# Altium project PCA950X.PrjPcb
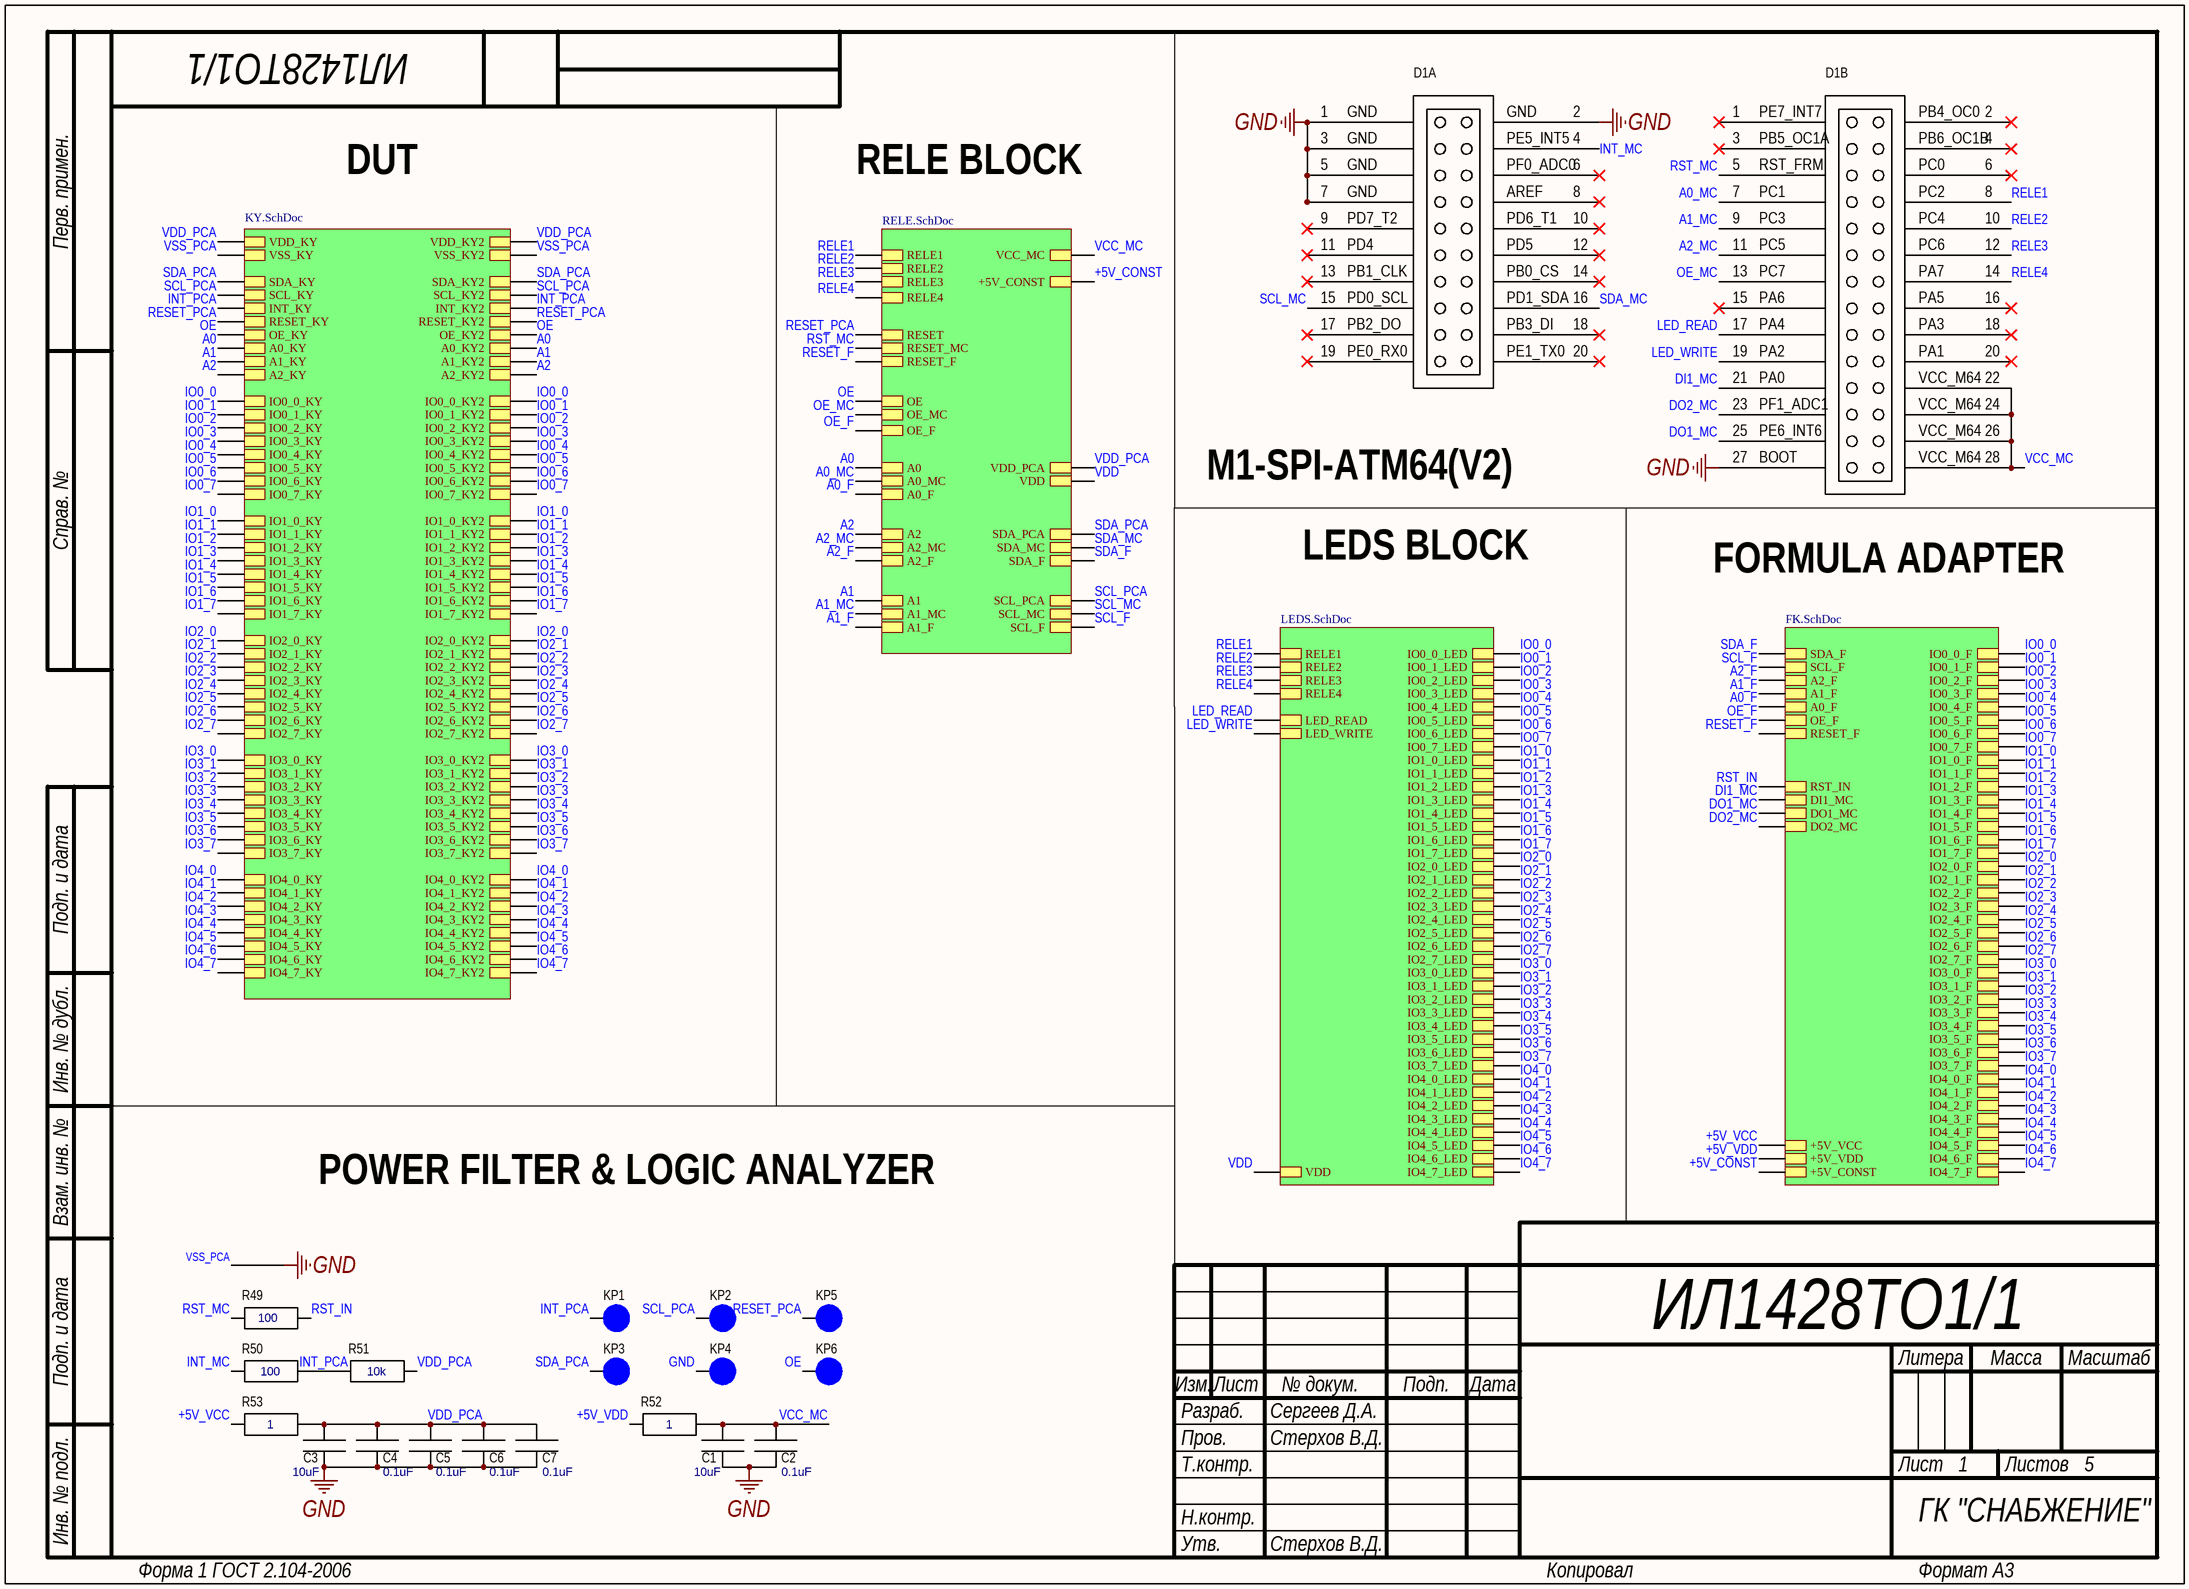
[diagram p0: Main Scheme.SchDoc]
5 sheets, 149 parts. Net scope: hierarchical (ports join the sheet entries above them; power ports are global).
Board file: PCB1.PcbDoc
Sheets:
  Main Scheme.SchDoc
    LEDS = LEDS.SchDoc
    FK = FK.SchDoc
    RELE = RELE.SchDoc
    UCP_s21 = KY.SchDoc

## Sheet Main Scheme.SchDoc: ИЛ1428ТО1/1
size 410 x 297 mm; ApprovedBy: Стерхов В.Д.; CheckedBy: Стерхов В.Д.; Author: Сергеев Д.А.; CompanyName: ГК "СНАБЖЕНИЕ"; DrawnBy: Сергеев Д.А.; Engineer: Сергеев Д.А.; Organization: ГК "СНАБЖЕНИЕ"; DocumentNumber: ИЛ1428ТО1/1; Revision: 1; SheetNumber: 1; SheetTotal: 5

### Parts
C1  10uF  [0805]
C2  0.1uF  [0805]
C3  10uF  [0805]
C4  0.1uF  [0805]
C5  0.1uF  [0805]
C6  0.1uF  [0805]
C7  0.1uF  [0805]
D1  M1-SPI-ATM64(V2)  [M1-SPI-ATM64(V2)]  (value not drawn)  (parts A,B of 2)
KP1  Contact  [Contact]  (value not drawn)
KP2  Contact  [Contact]  (value not drawn)
KP3  Contact  [Contact]  (value not drawn)
KP4  Contact  [Contact]  (value not drawn)
KP5  Contact  [Contact]  (value not drawn)
KP6  Contact  [Contact]  (value not drawn)
R49  100  [0805]
R50  100  [0805]
R51  10k  [0805]
R52  1  [0805]
R53  1  [0805]

### Sub-sheets
FK = FK.SchDoc: +5V_VCC, +5V_VDD, +5V_CONST, RESET_F, OE_F, A0_F, A1_F, A2_F, SDA_F, SCL_F, IO0_0_F, IO0_1_F, IO0_2_F, IO0_3_F, IO0_4_F, IO0_5_F, IO0_6_F, IO0_7_F, IO1_0_F, IO1_1_F, IO1_2_F, IO1_3_F, IO1_4_F, IO1_5_F, IO1_6_F, IO1_7_F, IO2_0_F, IO2_1_F, IO2_2_F, IO2_3_F, IO2_4_F, IO2_5_F, IO2_6_F, IO2_7_F, IO3_0_F, IO3_1_F, IO3_2_F, IO3_3_F, IO3_4_F, IO3_5_F, IO3_6_F, IO3_7_F, IO4_0_F, IO4_1_F, IO4_2_F, IO4_3_F, IO4_4_F, IO4_5_F, IO4_6_F, IO4_7_F, DI1_MC, DO1_MC, DO2_MC, RST_IN
LEDS = LEDS.SchDoc: VDD, IO0_0_LED, IO0_1_LED, IO0_2_LED, IO0_3_LED, IO0_4_LED, IO0_5_LED, IO0_6_LED, IO0_7_LED, IO1_0_LED, IO1_1_LED, IO1_2_LED, IO1_3_LED, IO1_4_LED, IO1_5_LED, IO1_6_LED, IO1_7_LED, IO2_0_LED, IO2_1_LED, IO2_2_LED, IO2_3_LED, IO2_4_LED, IO2_5_LED, IO2_6_LED, IO2_7_LED, IO3_0_LED, IO3_1_LED, IO3_2_LED, IO3_3_LED, IO3_4_LED, IO3_5_LED, IO3_6_LED, IO3_7_LED, IO4_0_LED, IO4_1_LED, IO4_2_LED, IO4_3_LED, IO4_4_LED, IO4_5_LED, IO4_6_LED, IO4_7_LED, RELE1, RELE2, LED_WRITE, LED_READ, RELE3, RELE4
RELE = RELE.SchDoc: +5V_CONST, SCL_PCA, SDA_PCA, SDA_MC, SCL_MC, VCC_MC, RELE1, SDA_F, SCL_F, VDD_PCA, VDD, RESET, RESET_MC, RESET_F, RELE2, A0, A0_MC, A0_F, A1, A1_MC, A1_F, RELE3, A2, A2_MC, A2_F, OE, OE_MC, OE_F, RELE4
UCP_s21 = KY.SchDoc: IO1_1_KY2, IO1_4_KY2, IO4_1_KY2, IO4_7_KY2, VDD_KY, IO4_0_KY2, IO4_4_KY2, IO4_3_KY2, VSS_KY, IO4_5_KY2, IO3_7_KY2, IO3_6_KY2, IO2_1_KY2, SCL_KY2, IO2_6_KY2, IO2_0_KY2, OE_KY2, A2_KY2, VDD_KY2, IO2_2_KY2, IO2_4_KY2, IO1_3_KY2, IO1_2_KY2, IO3_5_KY2, IO2_3_KY2, A0_KY2, IO1_7_KY2, A1_KY2, SDA_KY2, IO3_1_KY2, IO2_5_KY2, IO2_7_KY2, IO3_0_KY2, VSS_KY2, IO1_0_KY2, IO3_3_KY2, RESET_KY2, INT_KY2, IO4_2_KY2, IO4_6_KY2, IO1_6_KY2, IO3_4_KY2, INT_KY, IO1_5_KY2, IO3_2_KY2, IO0_7_KY2, IO0_5_KY2, IO0_6_KY2, SCL_KY, IO0_7_KY, IO1_3_KY, IO0_3_KY2, IO0_4_KY2, IO3_2_KY, RESET_KY, OE_KY, IO1_7_KY, IO0_3_KY, IO2_5_KY, IO3_4_KY, IO1_0_KY, IO0_6_KY, IO0_2_KY, IO2_7_KY, IO2_0_KY, IO3_1_KY, IO4_3_KY, IO0_4_KY, IO0_5_KY, IO3_7_KY, IO3_3_KY, IO3_6_KY, IO1_4_KY, IO1_5_KY, IO4_6_KY, IO4_1_KY, IO0_0_KY2, IO2_2_KY, IO0_1_KY, IO3_0_KY, IO2_1_KY, IO3_5_KY, IO1_1_KY, IO4_4_KY, IO4_2_KY, A0_KY, A1_KY, IO1_2_KY, IO2_3_KY, IO0_2_KY2, A2_KY, IO2_4_KY, IO4_7_KY, IO0_1_KY2, IO1_6_KY, SDA_KY, IO4_5_KY, IO2_6_KY, IO0_0_KY, IO4_0_KY

### Nets
GND: C1.2 C2.2 C3.2 C4.2 C5.2 C6.2 C7.2 D1.1X2 D1.2X2 D1.3X2 D1.5X2 D1.7X2 D1.27X3 KP4.1 ; sheet UCP_s21/VSS_KY, sheet UCP_s21/VSS_KY2  [also labelled VSS_PCA]
+5V_CONST: sheet FK/+5V_CONST, sheet RELE/+5V_CONST
+5V_VCC: R53.1 ; sheet FK/+5V_VCC
+5V_VDD: R52.1 ; sheet FK/+5V_VDD
A0: sheet RELE/A0, sheet UCP_s21/A0_KY2, sheet UCP_s21/A0_KY
A0_F: sheet FK/A0_F, sheet RELE/A0_F
A0_MC: D1.7X3 ; sheet RELE/A0_MC
A1: sheet RELE/A1, sheet UCP_s21/A1_KY2, sheet UCP_s21/A1_KY
A1_F: sheet FK/A1_F, sheet RELE/A1_F
A1_MC: D1.9X3 ; sheet RELE/A1_MC
A2: sheet RELE/A2, sheet UCP_s21/A2_KY2, sheet UCP_s21/A2_KY
A2_F: sheet FK/A2_F, sheet RELE/A2_F
A2_MC: D1.11X3 ; sheet RELE/A2_MC
DI1_MC: D1.21X3 ; sheet FK/DI1_MC
DO1_MC: D1.25X3 ; sheet FK/DO1_MC
DO2_MC: D1.23X3 ; sheet FK/DO2_MC
INT_MC: D1.4X2 R50.1
INT_PCA: KP1.1 R50.2 R51.1 ; sheet UCP_s21/INT_KY2, sheet UCP_s21/INT_KY
IO0_0: sheet LEDS/IO0_0_LED, sheet FK/IO0_0_F, sheet UCP_s21/IO0_0_KY2, sheet UCP_s21/IO0_0_KY
IO0_1: sheet LEDS/IO0_1_LED, sheet FK/IO0_1_F, sheet UCP_s21/IO0_1_KY, sheet UCP_s21/IO0_1_KY2
IO0_2: sheet LEDS/IO0_2_LED, sheet FK/IO0_2_F, sheet UCP_s21/IO0_2_KY, sheet UCP_s21/IO0_2_KY2
IO0_3: sheet LEDS/IO0_3_LED, sheet FK/IO0_3_F, sheet UCP_s21/IO0_3_KY2, sheet UCP_s21/IO0_3_KY
IO0_4: sheet LEDS/IO0_4_LED, sheet FK/IO0_4_F, sheet UCP_s21/IO0_4_KY2, sheet UCP_s21/IO0_4_KY
IO0_5: sheet LEDS/IO0_5_LED, sheet FK/IO0_5_F, sheet UCP_s21/IO0_5_KY2, sheet UCP_s21/IO0_5_KY
IO0_6: sheet LEDS/IO0_6_LED, sheet FK/IO0_6_F, sheet UCP_s21/IO0_6_KY2, sheet UCP_s21/IO0_6_KY
IO0_7: sheet LEDS/IO0_7_LED, sheet FK/IO0_7_F, sheet UCP_s21/IO0_7_KY2, sheet UCP_s21/IO0_7_KY
IO1_0: sheet LEDS/IO1_0_LED, sheet FK/IO1_0_F, sheet UCP_s21/IO1_0_KY2, sheet UCP_s21/IO1_0_KY
IO1_1: sheet LEDS/IO1_1_LED, sheet FK/IO1_1_F, sheet UCP_s21/IO1_1_KY2, sheet UCP_s21/IO1_1_KY
IO1_2: sheet LEDS/IO1_2_LED, sheet FK/IO1_2_F, sheet UCP_s21/IO1_2_KY2, sheet UCP_s21/IO1_2_KY
IO1_3: sheet LEDS/IO1_3_LED, sheet FK/IO1_3_F, sheet UCP_s21/IO1_3_KY2, sheet UCP_s21/IO1_3_KY
IO1_4: sheet LEDS/IO1_4_LED, sheet FK/IO1_4_F, sheet UCP_s21/IO1_4_KY2, sheet UCP_s21/IO1_4_KY
IO1_5: sheet LEDS/IO1_5_LED, sheet FK/IO1_5_F, sheet UCP_s21/IO1_5_KY2, sheet UCP_s21/IO1_5_KY
IO1_6: sheet LEDS/IO1_6_LED, sheet FK/IO1_6_F, sheet UCP_s21/IO1_6_KY2, sheet UCP_s21/IO1_6_KY
IO1_7: sheet LEDS/IO1_7_LED, sheet FK/IO1_7_F, sheet UCP_s21/IO1_7_KY2, sheet UCP_s21/IO1_7_KY
IO2_0: sheet LEDS/IO2_0_LED, sheet FK/IO2_0_F, sheet UCP_s21/IO2_0_KY2, sheet UCP_s21/IO2_0_KY
IO2_1: sheet LEDS/IO2_1_LED, sheet FK/IO2_1_F, sheet UCP_s21/IO2_1_KY2, sheet UCP_s21/IO2_1_KY
IO2_2: sheet LEDS/IO2_2_LED, sheet FK/IO2_2_F, sheet UCP_s21/IO2_2_KY2, sheet UCP_s21/IO2_2_KY
IO2_3: sheet LEDS/IO2_3_LED, sheet FK/IO2_3_F, sheet UCP_s21/IO2_3_KY2, sheet UCP_s21/IO2_3_KY
IO2_4: sheet LEDS/IO2_4_LED, sheet FK/IO2_4_F, sheet UCP_s21/IO2_4_KY2, sheet UCP_s21/IO2_4_KY
IO2_5: sheet LEDS/IO2_5_LED, sheet FK/IO2_5_F, sheet UCP_s21/IO2_5_KY2, sheet UCP_s21/IO2_5_KY
IO2_6: sheet LEDS/IO2_6_LED, sheet FK/IO2_6_F, sheet UCP_s21/IO2_6_KY2, sheet UCP_s21/IO2_6_KY
IO2_7: sheet LEDS/IO2_7_LED, sheet FK/IO2_7_F, sheet UCP_s21/IO2_7_KY2, sheet UCP_s21/IO2_7_KY
IO3_0: sheet LEDS/IO3_0_LED, sheet FK/IO3_0_F, sheet UCP_s21/IO3_0_KY2, sheet UCP_s21/IO3_0_KY
IO3_1: sheet LEDS/IO3_1_LED, sheet FK/IO3_1_F, sheet UCP_s21/IO3_1_KY2, sheet UCP_s21/IO3_1_KY
IO3_2: sheet LEDS/IO3_2_LED, sheet FK/IO3_2_F, sheet UCP_s21/IO3_2_KY2, sheet UCP_s21/IO3_2_KY
IO3_3: sheet LEDS/IO3_3_LED, sheet FK/IO3_3_F, sheet UCP_s21/IO3_3_KY2, sheet UCP_s21/IO3_3_KY
IO3_4: sheet LEDS/IO3_4_LED, sheet FK/IO3_4_F, sheet UCP_s21/IO3_4_KY2, sheet UCP_s21/IO3_4_KY
IO3_5: sheet LEDS/IO3_5_LED, sheet FK/IO3_5_F, sheet UCP_s21/IO3_5_KY2, sheet UCP_s21/IO3_5_KY
IO3_6: sheet LEDS/IO3_6_LED, sheet FK/IO3_6_F, sheet UCP_s21/IO3_6_KY2, sheet UCP_s21/IO3_6_KY
IO3_7: sheet LEDS/IO3_7_LED, sheet FK/IO3_7_F, sheet UCP_s21/IO3_7_KY2, sheet UCP_s21/IO3_7_KY
IO4_0: sheet LEDS/IO4_0_LED, sheet FK/IO4_0_F, sheet UCP_s21/IO4_0_KY2, sheet UCP_s21/IO4_0_KY
IO4_1: sheet LEDS/IO4_1_LED, sheet FK/IO4_1_F, sheet UCP_s21/IO4_1_KY2, sheet UCP_s21/IO4_1_KY
IO4_2: sheet LEDS/IO4_2_LED, sheet FK/IO4_2_F, sheet UCP_s21/IO4_2_KY2, sheet UCP_s21/IO4_2_KY
IO4_3: sheet LEDS/IO4_3_LED, sheet FK/IO4_3_F, sheet UCP_s21/IO4_3_KY2, sheet UCP_s21/IO4_3_KY
IO4_4: sheet LEDS/IO4_4_LED, sheet FK/IO4_4_F, sheet UCP_s21/IO4_4_KY2, sheet UCP_s21/IO4_4_KY
IO4_5: sheet LEDS/IO4_5_LED, sheet FK/IO4_5_F, sheet UCP_s21/IO4_5_KY2, sheet UCP_s21/IO4_5_KY
IO4_6: sheet LEDS/IO4_6_LED, sheet FK/IO4_6_F, sheet UCP_s21/IO4_6_KY2, sheet UCP_s21/IO4_6_KY
IO4_7: sheet LEDS/IO4_7_LED, sheet FK/IO4_7_F, sheet UCP_s21/IO4_7_KY2, sheet UCP_s21/IO4_7_KY
LED_READ: D1.17X3 ; sheet LEDS/LED_READ
LED_WRITE: D1.19X3 ; sheet LEDS/LED_WRITE
OE: KP6.1 ; sheet RELE/OE, sheet UCP_s21/OE_KY2, sheet UCP_s21/OE_KY
OE_F: sheet FK/OE_F, sheet RELE/OE_F
OE_MC: D1.13X3 ; sheet RELE/OE_MC
RELE1: D1.8X3 ; sheet LEDS/RELE1, sheet RELE/RELE1
RELE2: D1.10X3 ; sheet LEDS/RELE2, sheet RELE/RELE2
RELE3: D1.12X3 ; sheet LEDS/RELE3, sheet RELE/RELE3
RELE4: D1.14X3 ; sheet LEDS/RELE4, sheet RELE/RELE4
RESET_F: sheet FK/RESET_F, sheet RELE/RESET_F
RESET_PCA: KP5.1 ; sheet RELE/RESET, sheet UCP_s21/RESET_KY2, sheet UCP_s21/RESET_KY  [project net RESET]
RST_IN: R49.2 ; sheet FK/RST_IN
RST_MC: D1.5X3 R49.1 ; sheet RELE/RESET_MC  [project net RESET_MC]
SCL_F: sheet FK/SCL_F, sheet RELE/SCL_F
SCL_MC: D1.15X2 ; sheet RELE/SCL_MC
SCL_PCA: KP2.1 ; sheet RELE/SCL_PCA, sheet UCP_s21/SCL_KY2, sheet UCP_s21/SCL_KY
SDA_F: sheet FK/SDA_F, sheet RELE/SDA_F
SDA_MC: D1.16X2 ; sheet RELE/SDA_MC
SDA_PCA: KP3.1 ; sheet RELE/SDA_PCA, sheet UCP_s21/SDA_KY2, sheet UCP_s21/SDA_KY
VCC_MC: C1.1 C2.1 D1.22X3 D1.24X3 D1.26X3 D1.28X3 R52.2 ; sheet RELE/VCC_MC
VDD: sheet LEDS/VDD, sheet RELE/VDD
VDD_PCA: C3.1 C4.1 C5.1 C6.1 C7.1 R51.2 R53.2 ; sheet RELE/VDD_PCA, sheet UCP_s21/VDD_KY, sheet UCP_s21/VDD_KY2

Not connected (* = marked no-connect by the designer): D1 1X3* 2X3* 3X3* 4X3* 6X2* 6X3* 8X2* 9X2* 10X2* 11X2* 12X2* 13X2* 14X2* 15X3* 16X3* 17X2* 18X2* 18X3* 19X2* 20X2* 20X3*

### Notes on the sheet
- DUT
- RELE BLOCK
- M1-SPI-ATM64(V2)
- LEDS BLOCK
- FORMULA ADAPTER
- POWER FILTER & LOGIC ANALYZER
- Перв. примен.
- Справ. №
- Подп. и дата
- Инв. № дубл.
- Взам. инв. №
- Разраб.
- Изм.
- Лист
- № докум.
- Подп.
- Дата
- Литера
- Масса
- Масштаб
- Пров.
- Т.контр.
- Листов
- Инв. № подл.
- Н.контр.
- Утв.
- Форма 1 ГОСТ 2.104-2006
- Копировал
- Формат А3
- (in symbol 9DB102BGILF) PLL_BW; VDDA; PCIE BUF; CLK_INT; GNDA; CLK_INC; IREF; vCLKREQ0#; vCLKREQ1#; VDD; GND; PCIEXT0; PCIEXT2; PCIEXC0; PCIEXC1; SMBDAT; SMBCLK
- (in symbol M1-SPI-ATM64(V2), part A) GND; 3; PE5_INT5; 4; 5; PF0_ADC0; 6; 7; AREF; 8; 9; PD7_T2; PD6_T1; 10; 11; PD4; PD5; 12; 13; PB1_CLK; PB0_CS; 14; 15; PD0_SCL; PD1_SDA; 16; 17; PB2_DO; PB3_DI; 18; 19; PE0_RX0; PE1_TX0; 20
- (in symbol M1-SPI-ATM64(V2), part B) PE7_INT7; PB4_OC0; 3; PB5_OC1A; PB6_OC1B; 4; 5; RST_FRM; PC0; 6; 7; PC1; PC2; 8; 9; PC3; PC4; 10; 11; PC5; PC6; 12; 13; PC7; PA7; 14; 15; PA6; PA5; 16; 17; PA4; PA3; 18; 19; PA2; PA1; 20; 21; PA0; VCC_M64; 22; 23; PF1_ADC1; 24; 25; PE6_INT6; 26; 27; BOOT; 28
- (in symbol MCP1700T-3302E/TT) *STU

### Library data of the parts
C1-C7 = C0805: ComponentHeigt: 1.3; Firme: AVX; Leadform: SMD; KIND: Конденсатор; ClassName: *; Component Link: *; ComponentWeigt: *; Packaging: 0805; NN: *; Value: *
D1 = M1-SPI-ATM64(V2): ComponentHeigt: 5.5; Name: Вилка; Specification: Вилка PLD2-2 *; Typ: PLD2-2; ClassName: *; Component Link: *; ComponentWeigt: *; Firme: *; Leadform: *; NN: *; KIND: *
R49-R53 = R0805 Yageo: ComponentHeigt: 0.6; Firme: Yageo; Leadform: SMD; Kind: Резистор; ClassName: *; ComponentWeigt: *; Component Link: *; Packaging: 0805; NN: *; Value: *

## Sheet LEDS.SchDoc: ИЛ1428ТО1/1
size 410 x 297 mm; ApprovedBy: Стерхов В.Д.; CheckedBy: Стерхов В.Д.; Author: Сергеев Д.А.; CompanyName: ГК "СНАБЖЕНИЕ"; DrawnBy: Сергеев Д.А.; Engineer: Сергеев Д.А.; Organization: ГК "СНАБЖЕНИЕ"; DocumentNumber: ИЛ1428ТО1/1; Revision: 1; SheetNumber: 3; SheetTotal: 5
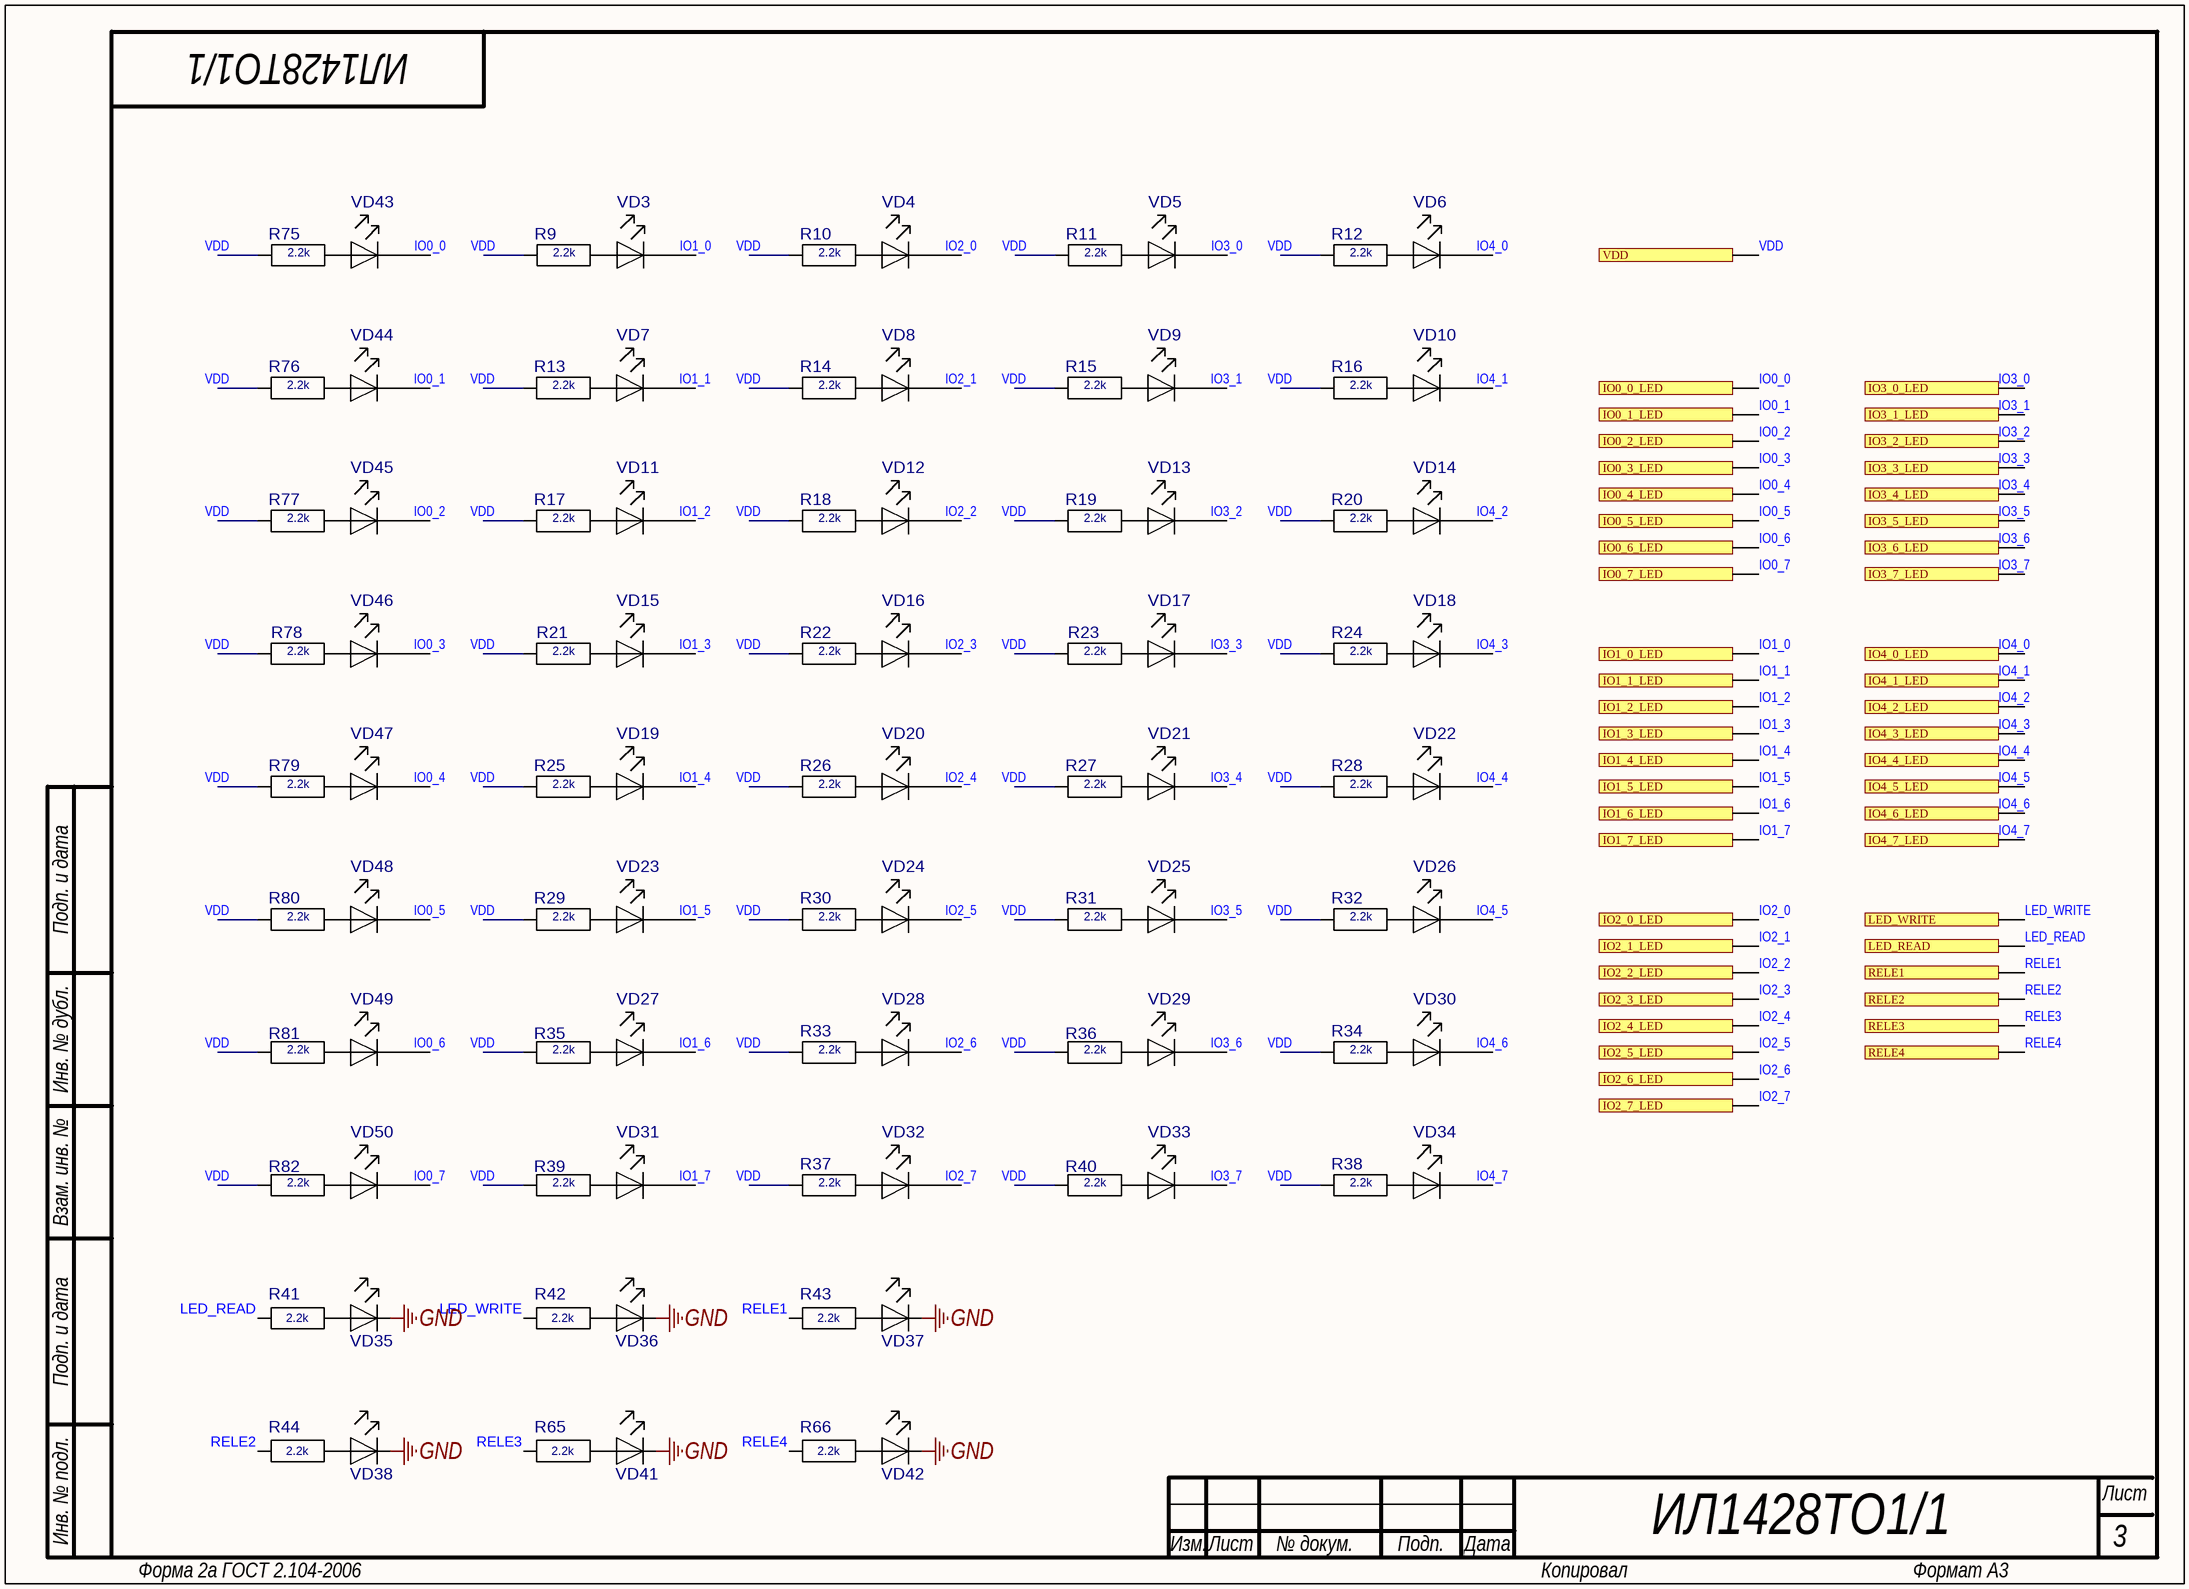
[diagram p1: LEDS.SchDoc]

### Parts
R9  2.2k  [0805]
R10  2.2k  [0805]
R11  2.2k  [0805]
R12  2.2k  [0805]
R13  2.2k  [0805]
R14  2.2k  [0805]
R15  2.2k  [0805]
R16  2.2k  [0805]
R17  2.2k  [0805]
R18  2.2k  [0805]
R19  2.2k  [0805]
R20  2.2k  [0805]
R21  2.2k  [0805]
R22  2.2k  [0805]
R23  2.2k  [0805]
R24  2.2k  [0805]
R25  2.2k  [0805]
R26  2.2k  [0805]
R27  2.2k  [0805]
R28  2.2k  [0805]
R29  2.2k  [0805]
R30  2.2k  [0805]
R31  2.2k  [0805]
R32  2.2k  [0805]
R33  2.2k  [0805]
R34  2.2k  [0805]
R35  2.2k  [0805]
R36  2.2k  [0805]
R37  2.2k  [0805]
R38  2.2k  [0805]
R39  2.2k  [0805]
R40  2.2k  [0805]
R41  2.2k  [0805]
R42  2.2k  [0805]
R43  2.2k  [0805]
R44  2.2k  [0805]
R65  2.2k  [0805]
R66  2.2k  [0805]
R75  2.2k  [0805]
R76  2.2k  [0805]
R77  2.2k  [0805]
R78  2.2k  [0805]
R79  2.2k  [0805]
R80  2.2k  [0805]
R81  2.2k  [0805]
R82  2.2k  [0805]
VD3  LED(0805)  [0805(LED)]  (value not drawn)
VD4  LED(0805)  [0805(LED)]  (value not drawn)
VD5  LED(0805)  [0805(LED)]  (value not drawn)
VD6  LED(0805)  [0805(LED)]  (value not drawn)
VD7  LED(0805)  [0805(LED)]  (value not drawn)
VD8  LED(0805)  [0805(LED)]  (value not drawn)
VD9  LED(0805)  [0805(LED)]  (value not drawn)
VD10  LED(0805)  [0805(LED)]  (value not drawn)
VD11  LED(0805)  [0805(LED)]  (value not drawn)
VD12  LED(0805)  [0805(LED)]  (value not drawn)
VD13  LED(0805)  [0805(LED)]  (value not drawn)
VD14  LED(0805)  [0805(LED)]  (value not drawn)
VD15  LED(0805)  [0805(LED)]  (value not drawn)
VD16  LED(0805)  [0805(LED)]  (value not drawn)
VD17  LED(0805)  [0805(LED)]  (value not drawn)
VD18  LED(0805)  [0805(LED)]  (value not drawn)
VD19  LED(0805)  [0805(LED)]  (value not drawn)
VD20  LED(0805)  [0805(LED)]  (value not drawn)
VD21  LED(0805)  [0805(LED)]  (value not drawn)
VD22  LED(0805)  [0805(LED)]  (value not drawn)
VD23  LED(0805)  [0805(LED)]  (value not drawn)
VD24  LED(0805)  [0805(LED)]  (value not drawn)
VD25  LED(0805)  [0805(LED)]  (value not drawn)
VD26  LED(0805)  [0805(LED)]  (value not drawn)
VD27  LED(0805)  [0805(LED)]  (value not drawn)
VD28  LED(0805)  [0805(LED)]  (value not drawn)
VD29  LED(0805)  [0805(LED)]  (value not drawn)
VD30  LED(0805)  [0805(LED)]  (value not drawn)
VD31  LED(0805)  [0805(LED)]  (value not drawn)
VD32  LED(0805)  [0805(LED)]  (value not drawn)
VD33  LED(0805)  [0805(LED)]  (value not drawn)
VD34  LED(0805)  [0805(LED)]  (value not drawn)
VD35  LED(0805)  [0805(LED)]  (value not drawn)
VD36  LED(0805)  [0805(LED)]  (value not drawn)
VD37  LED(0805)  [0805(LED)]  (value not drawn)
VD38  LED(0805)  [0805(LED)]  (value not drawn)
VD41  LED(0805)  [0805(LED)]  (value not drawn)
VD42  LED(0805)  [0805(LED)]  (value not drawn)
VD43  LED(0805)  [0805(LED)]  (value not drawn)
VD44  LED(0805)  [0805(LED)]  (value not drawn)
VD45  LED(0805)  [0805(LED)]  (value not drawn)
VD46  LED(0805)  [0805(LED)]  (value not drawn)
VD47  LED(0805)  [0805(LED)]  (value not drawn)
VD48  LED(0805)  [0805(LED)]  (value not drawn)
VD49  LED(0805)  [0805(LED)]  (value not drawn)
VD50  LED(0805)  [0805(LED)]  (value not drawn)

### Ports
IO0_0_LED, IO0_1_LED, IO0_2_LED, IO0_3_LED, IO0_4_LED, IO0_5_LED, IO0_6_LED, IO0_7_LED, IO1_0_LED, IO1_1_LED, IO1_2_LED, IO1_3_LED, IO1_4_LED, IO1_5_LED, IO1_6_LED, IO1_7_LED, IO2_0_LED, IO2_1_LED, IO2_2_LED, IO2_3_LED, IO2_4_LED, IO2_5_LED, IO2_6_LED, IO2_7_LED, IO3_0_LED, IO3_1_LED, IO3_2_LED, IO3_3_LED, IO3_4_LED, IO3_5_LED, IO3_6_LED, IO3_7_LED, IO4_0_LED, IO4_1_LED, IO4_2_LED, IO4_3_LED, IO4_4_LED, IO4_5_LED, IO4_6_LED, IO4_7_LED, LED_READ, LED_WRITE, RELE1, RELE2, RELE3, RELE4, VDD

### Nets
GND: VD35.2(K) VD36.2(K) VD37.2(K) VD38.2(K) VD41.2(K) VD42.2(K)
IO0_0: VD43.2(K) ; port IO0_0_LED
IO0_1: VD44.2(K) ; port IO0_1_LED
IO0_2: VD45.2(K) ; port IO0_2_LED
IO0_3: VD46.2(K) ; port IO0_3_LED
IO0_4: VD47.2(K) ; port IO0_4_LED
IO0_5: VD48.2(K) ; port IO0_5_LED
IO0_6: VD49.2(K) ; port IO0_6_LED
IO0_7: VD50.2(K) ; port IO0_7_LED
IO1_0: VD3.2(K) ; port IO1_0_LED
IO1_1: VD7.2(K) ; port IO1_1_LED
IO1_2: VD11.2(K) ; port IO1_2_LED
IO1_3: VD15.2(K) ; port IO1_3_LED
IO1_4: VD19.2(K) ; port IO1_4_LED
IO1_5: VD23.2(K) ; port IO1_5_LED
IO1_6: VD27.2(K) ; port IO1_6_LED
IO1_7: VD31.2(K) ; port IO1_7_LED
IO2_0: VD4.2(K) ; port IO2_0_LED
IO2_1: VD8.2(K) ; port IO2_1_LED
IO2_2: VD12.2(K) ; port IO2_2_LED
IO2_3: VD16.2(K) ; port IO2_3_LED
IO2_4: VD20.2(K) ; port IO2_4_LED
IO2_5: VD24.2(K) ; port IO2_5_LED
IO2_6: VD28.2(K) ; port IO2_6_LED
IO2_7: VD32.2(K) ; port IO2_7_LED
IO3_0: VD5.2(K) ; port IO3_0_LED
IO3_1: VD9.2(K) ; port IO3_1_LED
IO3_2: VD13.2(K) ; port IO3_2_LED
IO3_3: VD17.2(K) ; port IO3_3_LED
IO3_4: VD21.2(K) ; port IO3_4_LED
IO3_5: VD25.2(K) ; port IO3_5_LED
IO3_6: VD29.2(K) ; port IO3_6_LED
IO3_7: VD33.2(K) ; port IO3_7_LED
IO4_0: VD6.2(K) ; port IO4_0_LED
IO4_1: VD10.2(K) ; port IO4_1_LED
IO4_2: VD14.2(K) ; port IO4_2_LED
IO4_3: VD18.2(K) ; port IO4_3_LED
IO4_4: VD22.2(K) ; port IO4_4_LED
IO4_5: VD26.2(K) ; port IO4_5_LED
IO4_6: VD30.2(K) ; port IO4_6_LED
IO4_7: VD34.2(K) ; port IO4_7_LED
LED_READ: R41.1 ; port LED_READ
LED_WRITE: R42.1 ; port LED_WRITE
RELE1: R43.1 ; port RELE1
RELE2: R44.1 ; port RELE2
RELE3: R65.1 ; port RELE3
RELE4: R66.1 ; port RELE4
VDD: R9.1 R10.1 R11.1 R12.1 R13.1 R14.1 R15.1 R16.1 R17.1 R18.1 R19.1 R20.1 R21.1 R22.1 R23.1 R24.1 R25.1 R26.1 R27.1 R28.1 R29.1 R30.1 R31.1 R32.1 R33.1 R34.1 R35.1 R36.1 R37.1 R38.1 R39.1 R40.1 R75.1 R76.1 R77.1 R78.1 R79.1 R80.1 R81.1 R82.1 ; port VDD
NetR9_2: R9.2 VD3.1(A)
NetR10_2: R10.2 VD4.1(A)
NetR11_2: R11.2 VD5.1(A)
NetR12_2: R12.2 VD6.1(A)
NetR13_2: R13.2 VD7.1(A)
NetR14_2: R14.2 VD8.1(A)
NetR15_2: R15.2 VD9.1(A)
NetR16_2: R16.2 VD10.1(A)
NetR17_2: R17.2 VD11.1(A)
NetR18_2: R18.2 VD12.1(A)
NetR19_2: R19.2 VD13.1(A)
NetR20_2: R20.2 VD14.1(A)
NetR21_2: R21.2 VD15.1(A)
NetR22_2: R22.2 VD16.1(A)
NetR23_2: R23.2 VD17.1(A)
NetR24_2: R24.2 VD18.1(A)
NetR25_2: R25.2 VD19.1(A)
NetR26_2: R26.2 VD20.1(A)
NetR27_2: R27.2 VD21.1(A)
NetR28_2: R28.2 VD22.1(A)
NetR29_2: R29.2 VD23.1(A)
NetR30_2: R30.2 VD24.1(A)
NetR31_2: R31.2 VD25.1(A)
NetR32_2: R32.2 VD26.1(A)
NetR33_2: R33.2 VD28.1(A)
NetR34_2: R34.2 VD30.1(A)
NetR35_2: R35.2 VD27.1(A)
NetR36_2: R36.2 VD29.1(A)
NetR37_2: R37.2 VD32.1(A)
NetR38_2: R38.2 VD34.1(A)
NetR39_2: R39.2 VD31.1(A)
NetR40_2: R40.2 VD33.1(A)
NetR41_2: R41.2 VD35.1(A)
NetR42_2: R42.2 VD36.1(A)
NetR43_2: R43.2 VD37.1(A)
NetR44_2: R44.2 VD38.1(A)
NetR65_2: R65.2 VD41.1(A)
NetR66_2: R66.2 VD42.1(A)
NetR75_2: R75.2 VD43.1(A)
NetR76_2: R76.2 VD44.1(A)
NetR77_2: R77.2 VD45.1(A)
NetR78_2: R78.2 VD46.1(A)
NetR79_2: R79.2 VD47.1(A)
NetR80_2: R80.2 VD48.1(A)
NetR81_2: R81.2 VD49.1(A)
NetR82_2: R82.2 VD50.1(A)

### Notes on the sheet
- Подп. и дата
- Инв. № дубл.
- Взам. инв. №
- Инв. № подл.
- Изм.
- Лист
- № докум.
- Подп.
- Дата
- Форма 2а ГОСТ 2.104-2006
- Копировал
- Формат А3

### Library data of the parts
R9-R44 R65 R66 R75-R82 = R0805 Yageo: as R49 on sheet Main Scheme; ClassName: *; ComponentWeigt: *; Component Link: *; Packaging: 0805; NN: *; Value: *
VD3-VD38 VD41-VD50 = LED(0805): ComponentHeigt: 0.75; Leadform: в отверстия; Firme: Kingbright; NN: 24003000; KIND: Светодиод L-1154GD Kingbright; Component Link: *; ClassName: *

## Sheet FK.SchDoc: ИЛ1428ТО1/1
size 410 x 297 mm; ApprovedBy: Стерхов В.Д.; CheckedBy: Стерхов В.Д.; Author: Сергеев Д.А.; CompanyName: ГК "СНАБЖЕНИЕ"; DrawnBy: Сергеев Д.А.; Engineer: Сергеев Д.А.; Organization: ГК "СНАБЖЕНИЕ"; DocumentNumber: ИЛ1428ТО1/1; Revision: 1; SheetNumber: 2; SheetTotal: 5
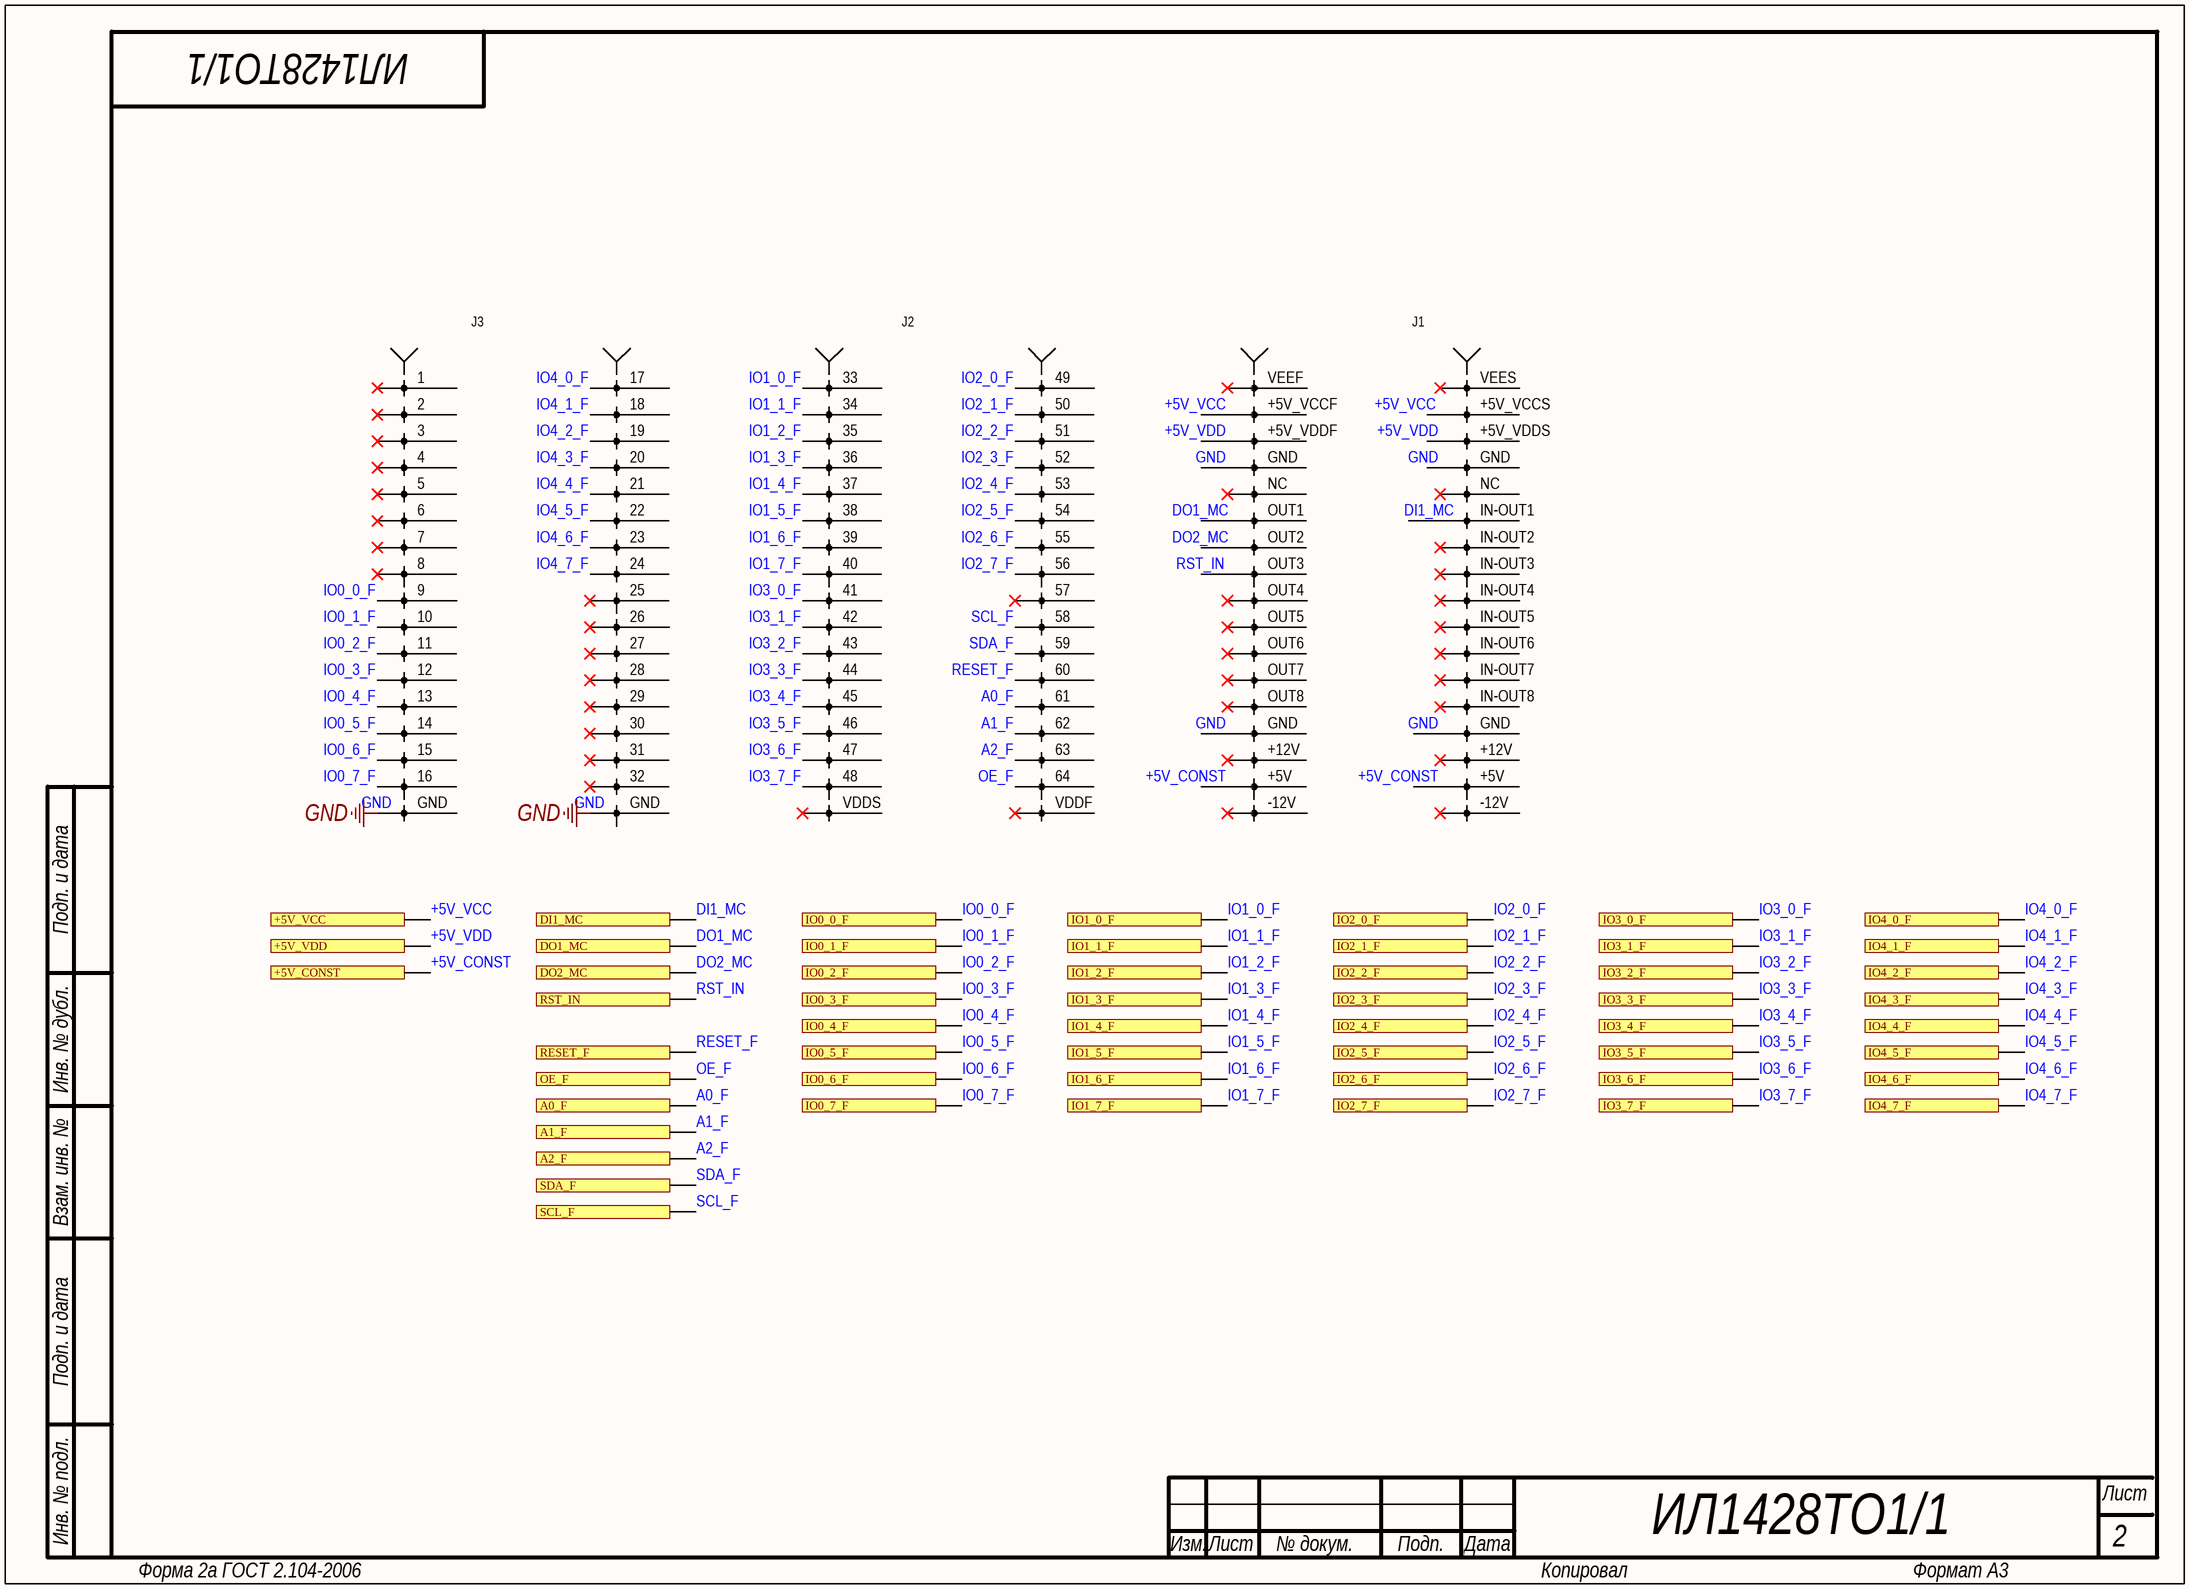
[diagram p2: FK.SchDoc]

### Parts
X1  FORMULA  [FORMULA]  (value not drawn)

### Ports
+5V_CONST, +5V_VCC, +5V_VDD, A0_F, A1_F, A2_F, DI1_MC, DO1_MC, DO2_MC, IO0_0_F, IO0_1_F, IO0_2_F, IO0_3_F, IO0_4_F, IO0_5_F, IO0_6_F, IO0_7_F, IO1_0_F, IO1_1_F, IO1_2_F, IO1_3_F, IO1_4_F, IO1_5_F, IO1_6_F, IO1_7_F, IO2_0_F, IO2_1_F, IO2_2_F, IO2_3_F, IO2_4_F, IO2_5_F, IO2_6_F, IO2_7_F, IO3_0_F, IO3_1_F, IO3_2_F, IO3_3_F, IO3_4_F, IO3_5_F, IO3_6_F, IO3_7_F, IO4_0_F, IO4_1_F, IO4_2_F, IO4_3_F, IO4_4_F, IO4_5_F, IO4_6_F, IO4_7_F, OE_F, RESET_F, RST_IN, SCL_F, SDA_F

### Nets
GND: X1.GND
+5V_CONST: X1.+5V ; port +5V_CONST
+5V_VCC: X1.+5V_VCCF(VCCF) X1.+5V_VCCS(VCCS) ; port +5V_VCC
+5V_VDD: X1.+5V_VDDF(VDDF) X1.+5V_VDDS(VDDS) ; port +5V_VDD
A0_F: X1.61 ; port A0_F
A1_F: X1.62 ; port A1_F
A2_F: X1.63 ; port A2_F
DI1_MC: X1.IN-OUT1 ; port DI1_MC
DO1_MC: X1.OUT1 ; port DO1_MC
DO2_MC: X1.OUT2 ; port DO2_MC
IO0_0_F: X1.9 ; port IO0_0_F  [project net IO0_0]
IO0_1_F: X1.10 ; port IO0_1_F  [project net IO0_1]
IO0_2_F: X1.11 ; port IO0_2_F  [project net IO0_2]
IO0_3_F: X1.12 ; port IO0_3_F  [project net IO0_3]
IO0_4_F: X1.13 ; port IO0_4_F  [project net IO0_4]
IO0_5_F: X1.14 ; port IO0_5_F  [project net IO0_5]
IO0_6_F: X1.15 ; port IO0_6_F  [project net IO0_6]
IO0_7_F: X1.16 ; port IO0_7_F  [project net IO0_7]
IO1_0_F: X1.33 ; port IO1_0_F  [project net IO1_0]
IO1_1_F: X1.34 ; port IO1_1_F  [project net IO1_1]
IO1_2_F: X1.35 ; port IO1_2_F  [project net IO1_2]
IO1_3_F: X1.36 ; port IO1_3_F  [project net IO1_3]
IO1_4_F: X1.37 ; port IO1_4_F  [project net IO1_4]
IO1_5_F: X1.38 ; port IO1_5_F  [project net IO1_5]
IO1_6_F: X1.39 ; port IO1_6_F  [project net IO1_6]
IO1_7_F: X1.40 ; port IO1_7_F  [project net IO1_7]
IO2_0_F: X1.49 ; port IO2_0_F  [project net IO2_0]
IO2_1_F: X1.50 ; port IO2_1_F  [project net IO2_1]
IO2_2_F: X1.51 ; port IO2_2_F  [project net IO2_2]
IO2_3_F: X1.52 ; port IO2_3_F  [project net IO2_3]
IO2_4_F: X1.53 ; port IO2_4_F  [project net IO2_4]
IO2_5_F: X1.54 ; port IO2_5_F  [project net IO2_5]
IO2_6_F: X1.55 ; port IO2_6_F  [project net IO2_6]
IO2_7_F: X1.56 ; port IO2_7_F  [project net IO2_7]
IO3_0_F: X1.41 ; port IO3_0_F  [project net IO3_0]
IO3_1_F: X1.42 ; port IO3_1_F  [project net IO3_1]
IO3_2_F: X1.43 ; port IO3_2_F  [project net IO3_2]
IO3_3_F: X1.44 ; port IO3_3_F  [project net IO3_3]
IO3_4_F: X1.45 ; port IO3_4_F  [project net IO3_4]
IO3_5_F: X1.46 ; port IO3_5_F  [project net IO3_5]
IO3_6_F: X1.47 ; port IO3_6_F  [project net IO3_6]
IO3_7_F: X1.48 ; port IO3_7_F  [project net IO3_7]
IO4_0_F: X1.17 ; port IO4_0_F  [project net IO4_0]
IO4_1_F: X1.18 ; port IO4_1_F  [project net IO4_1]
IO4_2_F: X1.19 ; port IO4_2_F  [project net IO4_2]
IO4_3_F: X1.20 ; port IO4_3_F  [project net IO4_3]
IO4_4_F: X1.21 ; port IO4_4_F  [project net IO4_4]
IO4_5_F: X1.22 ; port IO4_5_F  [project net IO4_5]
IO4_6_F: X1.23 ; port IO4_6_F  [project net IO4_6]
IO4_7_F: X1.24 ; port IO4_7_F  [project net IO4_7]
OE_F: X1.64 ; port OE_F
RESET_F: X1.60 ; port RESET_F
RST_IN: X1.OUT3 ; port RST_IN
SCL_F: X1.58 ; port SCL_F
SDA_F: X1.59 ; port SDA_F

Not connected (* = marked no-connect by the designer): X1 1* 2* 3* 4* 5* 6* 7* 8* 25* 26* 27* 28* 29* 30* 31* 32* 57* +12V* -12V* IN-OUT2* IN-OUT3* IN-OUT4* IN-OUT5* IN-OUT6* IN-OUT7* IN-OUT8* NC* OUT4* OUT5* OUT6* OUT7* OUT8* VDDF* VDDS* VEEF* VEES*

### Notes on the sheet
- Подп. и дата
- Инв. № дубл.
- Взам. инв. №
- Инв. № подл.
- Изм.
- Лист
- № докум.
- Подп.
- Дата
- Форма 2а ГОСТ 2.104-2006
- Копировал
- Формат А3
- (in symbol FORMULA) J3; J2; J1

## Sheet RELE.SchDoc: ИЛ1428ТО1/1
size 410 x 297 mm; ApprovedBy: Стерхов В.Д.; CheckedBy: Стерхов В.Д.; Author: Сергеев Д.А.; CompanyName: ГК "СНАБЖЕНИЕ"; DrawnBy: Сергеев Д.А.; Engineer: Сергеев Д.А.; Organization: ГК "СНАБЖЕНИЕ"; DocumentNumber: ИЛ1428ТО1/1; Revision: 1; SheetNumber: 4; SheetTotal: 5
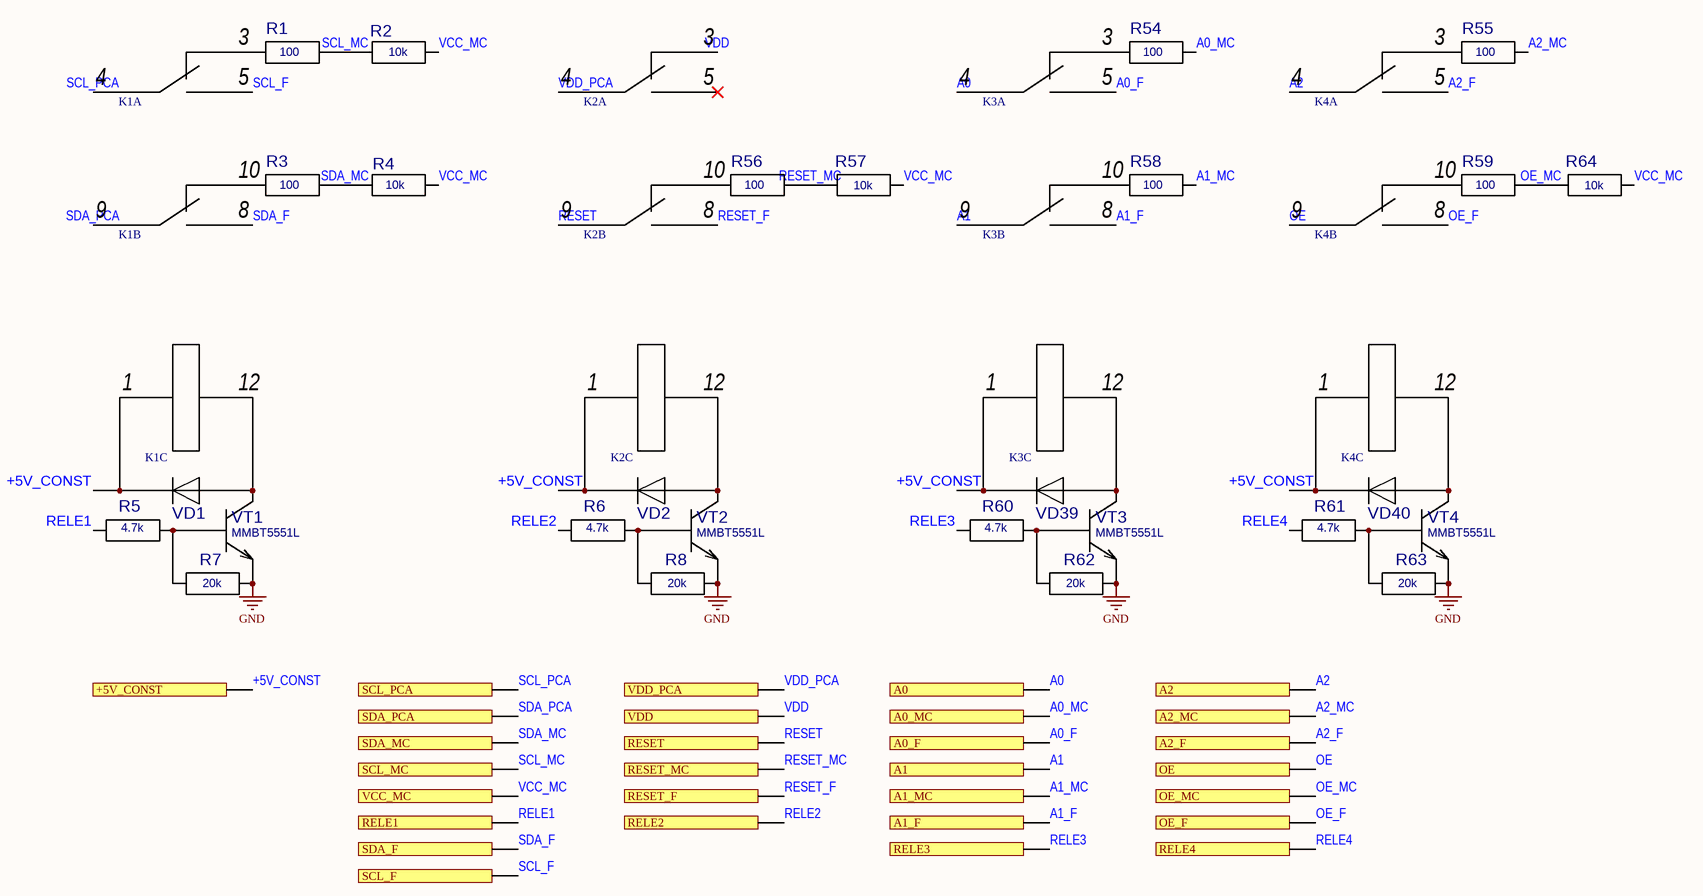
[diagram p3: RELE.SchDoc]

### Parts
K1  V23079A1001B301 TE  [V23079A1001B301]  (value not drawn)  (parts A,B,C of 3)
K2  V23079A1001B301 TE  [V23079A1001B301]  (value not drawn)  (parts A,B,C of 3)
K3  V23079A1001B301 TE  [V23079A1001B301]  (value not drawn)  (parts A,B,C of 3)
K4  V23079A1001B301 TE  [V23079A1001B301]  (value not drawn)  (parts A,B,C of 3)
R1  100  [0805]
R2  10k  [0805]
R3  100  [0805]
R4  10k  [0805]
R5  4.7k  [0805]
R6  4.7k  [0805]
R7  20k  [0805]
R8  20k  [0805]
R54  100  [0805]
R55  100  [0805]
R56  100  [0805]
R57  10k  [0805]
R58  100  [0805]
R59  100  [0805]
R60  4.7k  [0805]
R61  4.7k  [0805]
R62  20k  [0805]
R63  20k  [0805]
R64  10k  [0805]
VD1  LL4148 NXP  [SOD80C]  (value not drawn)
VD2  LL4148 NXP  [SOD80C]  (value not drawn)
VD39  LL4148 NXP  [SOD80C]  (value not drawn)
VD40  LL4148 NXP  [SOD80C]  (value not drawn)
VT1  MMBT5551L  [SOT-23]
VT2  MMBT5551L  [SOT-23]
VT3  MMBT5551L  [SOT-23]
VT4  MMBT5551L  [SOT-23]

### Ports
+5V_CONST, A0, A0_F, A0_MC, A1, A1_F, A1_MC, A2, A2_F, A2_MC, OE, OE_F, OE_MC, RELE1, RELE2, RELE3, RELE4, RESET, RESET_F, RESET_MC, SCL_F, SCL_MC, SCL_PCA, SDA_F, SDA_MC, SDA_PCA, VCC_MC, VDD, VDD_PCA

### Nets
GND: R7.2 R8.2 R62.2 R63.2 VT1.2(E) VT2.2(E) VT3.2(E) VT4.2(E)
+5V_CONST: K1.1 K2.1 K3.1 K4.1 VD1.2(K) VD2.2(K) VD39.2(K) VD40.2(K) ; port +5V_CONST
A0: K3.4 ; port A0
A0_F: K3.5 ; port A0_F
A0_MC: R54.2 ; port A0_MC
A1: K3.9 ; port A1
A1_F: K3.8 ; port A1_F
A1_MC: R58.2 ; port A1_MC
A2: K4.4 ; port A2
A2_F: K4.5 ; port A2_F
A2_MC: R55.2 ; port A2_MC
OE: K4.9 ; port OE
OE_F: K4.8 ; port OE_F
OE_MC: R59.2 R64.1 ; port OE_MC
RELE1: R5.1 ; port RELE1
RELE2: R6.1 ; port RELE2
RELE3: R60.1 ; port RELE3
RELE4: R61.1 ; port RELE4
RESET: K2.9 ; port RESET
RESET_F: K2.8 ; port RESET_F
RESET_MC: R56.2 R57.1 ; port RESET_MC
SCL_F: K1.5 ; port SCL_F
SCL_MC: R1.2 R2.1 ; port SCL_MC
SCL_PCA: K1.4 ; port SCL_PCA
SDA_F: K1.8 ; port SDA_F
SDA_MC: R3.2 R4.1 ; port SDA_MC
SDA_PCA: K1.9 ; port SDA_PCA
VCC_MC: R2.2 R4.2 R57.2 R64.2 ; port VCC_MC
VDD: K2.3 ; port VDD
VDD_PCA: K2.4 ; port VDD_PCA
NetK1_3: K1.3 R1.1
NetK1_10: K1.10 R3.1
NetK1_12: K1.12 VD1.1(A) VT1.3(K)
NetK2_10: K2.10 R56.1
NetK2_12: K2.12 VD2.1(A) VT2.3(K)
NetK3_3: K3.3 R54.1
NetK3_10: K3.10 R58.1
NetK3_12: K3.12 VD39.1(A) VT3.3(K)
NetK4_3: K4.3 R55.1
NetK4_10: K4.10 R59.1
NetK4_12: K4.12 VD40.1(A) VT4.3(K)
NetR5_2: R5.2 R7.1 VT1.1(B)
NetR6_2: R6.2 R8.1 VT2.1(B)
NetR60_2: R60.2 R62.1 VT3.1(B)
NetR61_2: R61.2 R63.1 VT4.1(B)

Not connected (* = marked no-connect by the designer): K2 5*

### Notes on the sheet
- Подп. и дата
- Инв. № дубл.
- Взам. инв. №
- Инв. № подл.
- Изм.
- Лист
- № докум.
- Подп.
- Дата
- Форма 2а ГОСТ 2.104-2006
- Копировал
- Формат А3

### Library data of the parts
R1-R8 R54-R64 = R0805 Yageo: as R49 on sheet Main Scheme; ClassName: *; ComponentWeigt: *; Component Link: *; Packaging: 0805; NN: *; Value: *
VD1 VD2 VD39 VD40 = LL4148 NXP: ComponentHeigt: 1.6; Leadform: SMD; NN: 24009301; KIND: Диод LL4148 NXP; Component Link: http://www.nxp.com; Packaging: SOD-80C; ClassName: *; Firme: NXP
VT1-VT4 = MMBT5551L: ComponentHeigt: 1.1; Firme: ONS; Leadform: SMD; NN: 24007468; KIND: Транзистор MMBT5551L*G ONS; ClassName: *; ComponentWeigt: *; Packaging: SOT-23

## Sheet KY.SchDoc: ИЛ1428ТО1/1
size 410 x 297 mm; ApprovedBy: Стерхов В.Д; CheckedBy: Стерхов В.Д; Author: Сергеев Д.А.; CompanyName: ГК "СНАБЖЕНИЕ"; DrawnBy: Сергеев Д.А.; Engineer: Сергеев Д.А.; Organization: ГК "СНАБЖЕНИЕ"; DocumentNumber: ИЛ1428ТО1/1; Revision: 1; SheetNumber: 5; SheetTotal: 5
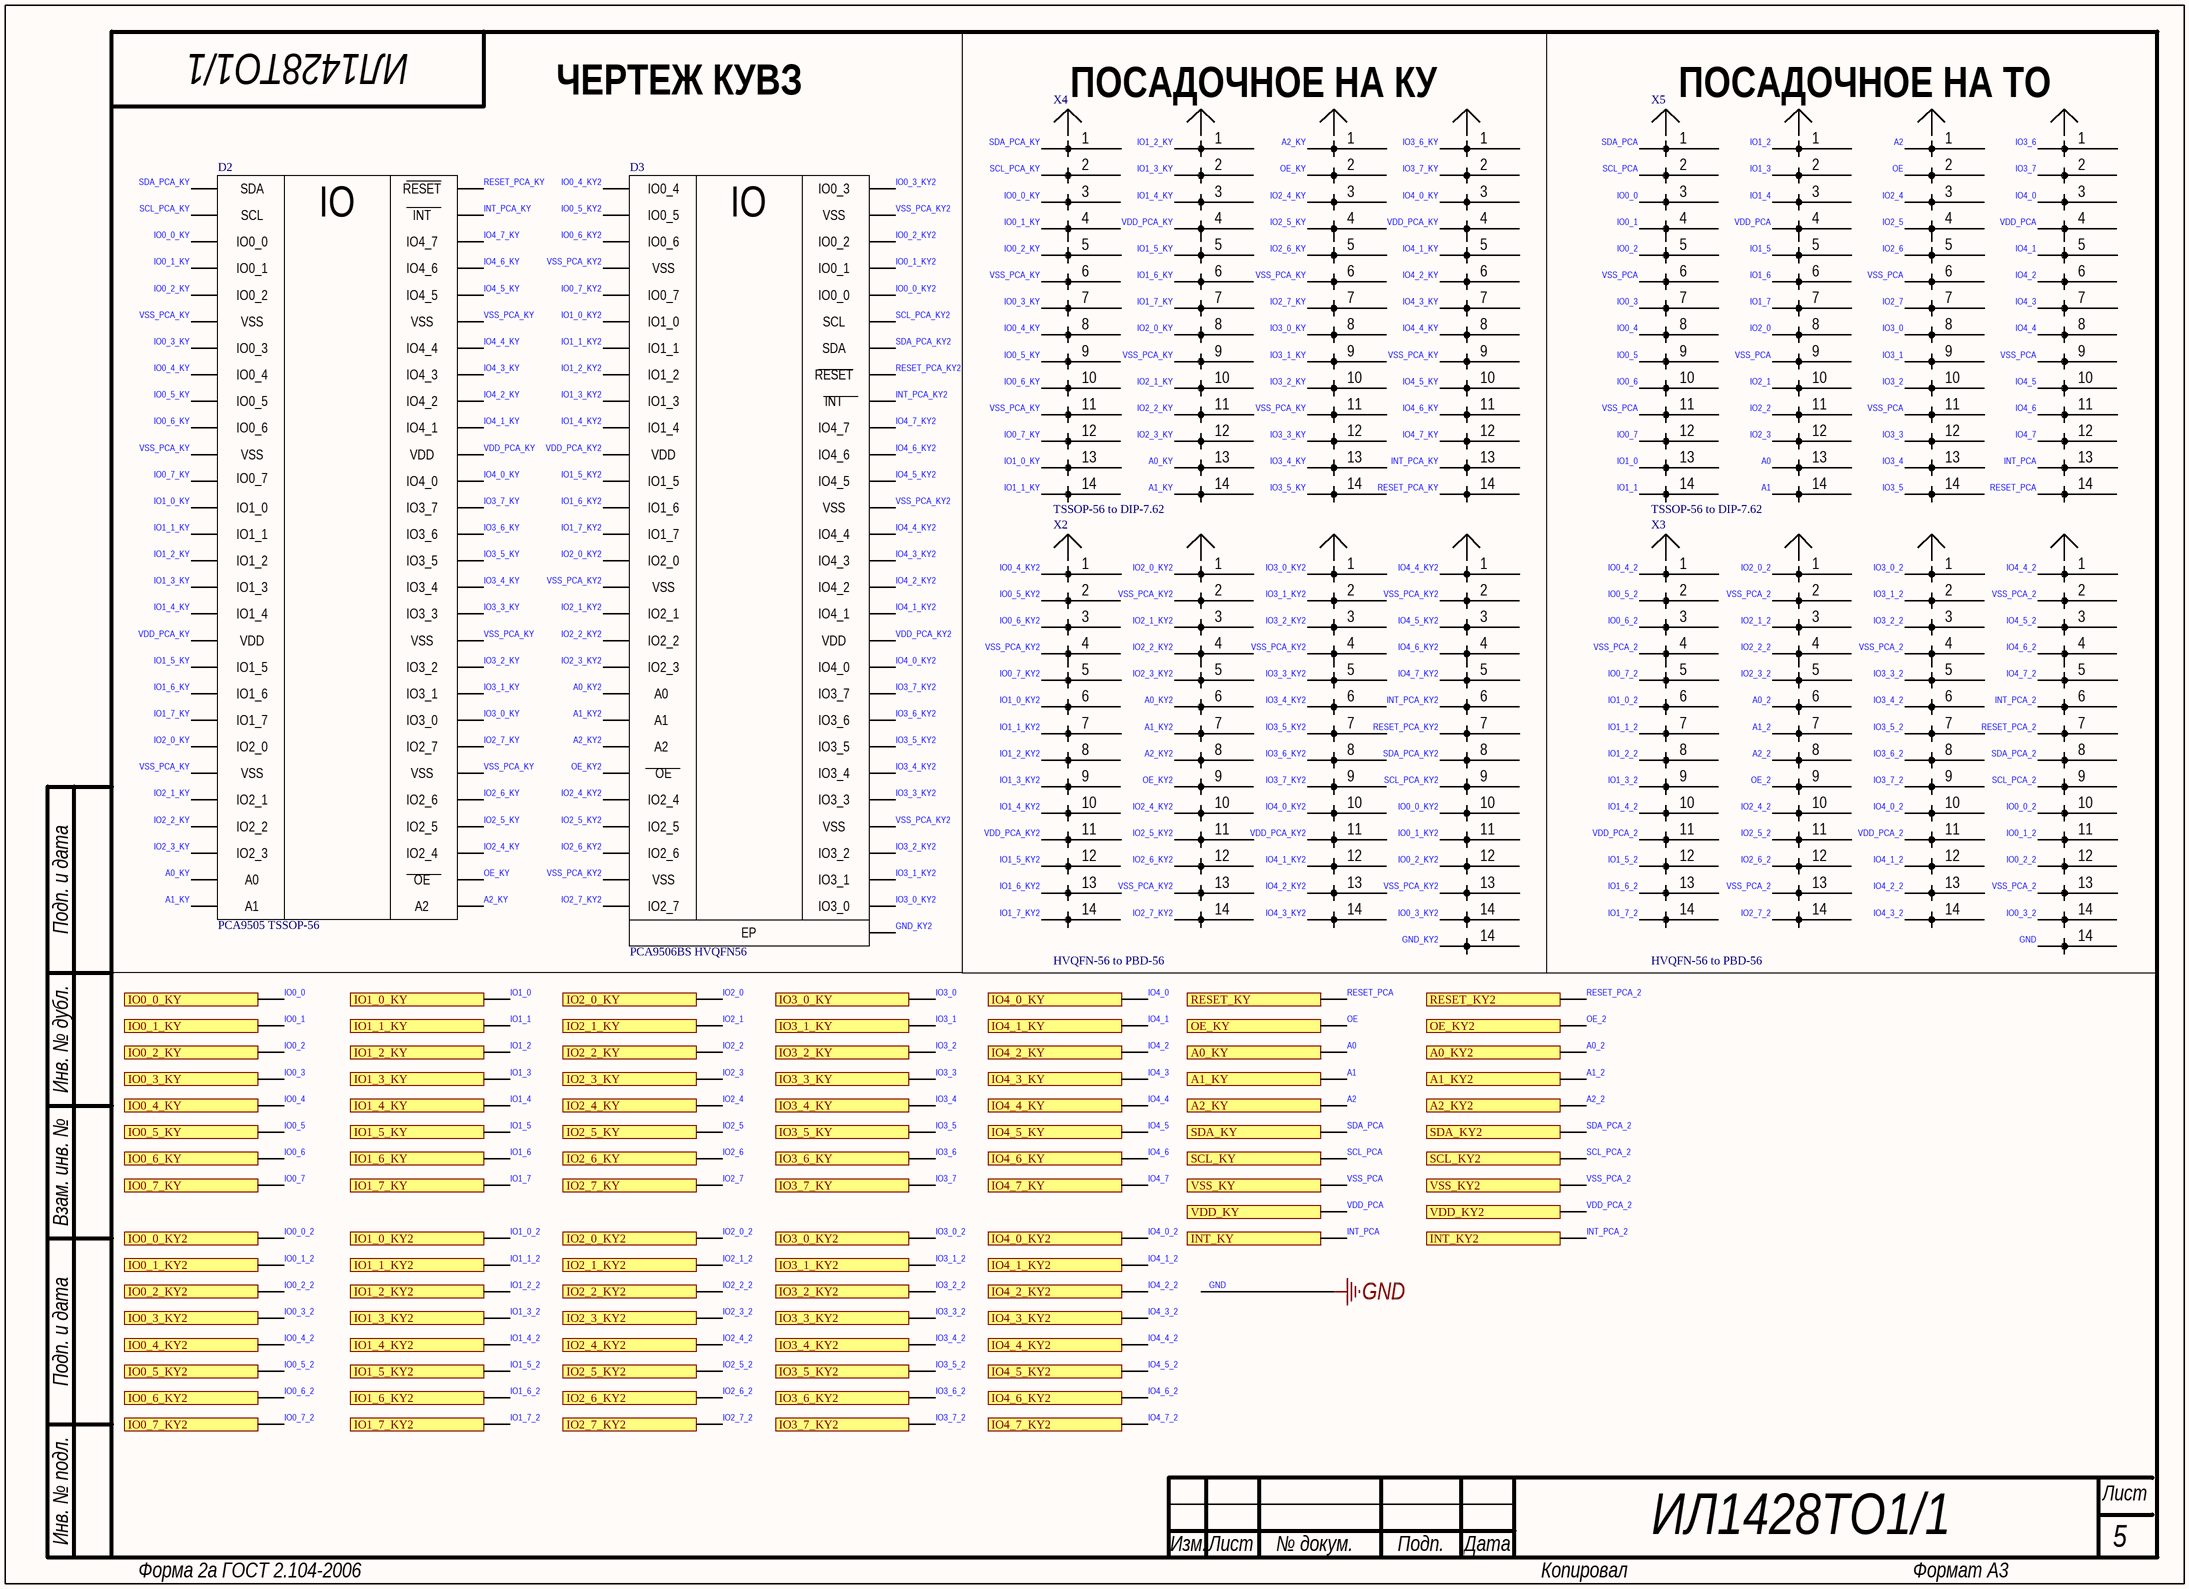
[diagram p4: KY.SchDoc]

### Parts
D2  PCA9505 TSSOP-56  [OTS-56(64)-0.5-02]
D3  PCA9506BS HVQFN56  [56QN50S18080]
X2  HVQFN-56 to PBD-56  [HVQFN-56 to PD-56]
X3  HVQFN-56 to PBD-56  [HVQFN-56 to PD-56]
X4  TSSOP-56 to DIP-7.62  [TSSOP-56 to DIP 7.62]
X5  TSSOP-56 to DIP-7.62  [TSSOP-56 to DIP 7.62]

### Ports
A0_KY, A0_KY2, A1_KY, A1_KY2, A2_KY, A2_KY2, INT_KY, INT_KY2, IO0_0_KY, IO0_0_KY2, IO0_1_KY, IO0_1_KY2, IO0_2_KY, IO0_2_KY2, IO0_3_KY, IO0_3_KY2, IO0_4_KY, IO0_4_KY2, IO0_5_KY, IO0_5_KY2, IO0_6_KY, IO0_6_KY2, IO0_7_KY, IO0_7_KY2, IO1_0_KY, IO1_0_KY2, IO1_1_KY, IO1_1_KY2, IO1_2_KY, IO1_2_KY2, IO1_3_KY, IO1_3_KY2, IO1_4_KY, IO1_4_KY2, IO1_5_KY, IO1_5_KY2, IO1_6_KY, IO1_6_KY2, IO1_7_KY, IO1_7_KY2, IO2_0_KY, IO2_0_KY2, IO2_1_KY, IO2_1_KY2, IO2_2_KY, IO2_2_KY2, IO2_3_KY, IO2_3_KY2, IO2_4_KY, IO2_4_KY2, IO2_5_KY, IO2_5_KY2, IO2_6_KY, IO2_6_KY2, IO2_7_KY, IO2_7_KY2, IO3_0_KY, IO3_0_KY2, IO3_1_KY, IO3_1_KY2, IO3_2_KY, IO3_2_KY2, IO3_3_KY, IO3_3_KY2, IO3_4_KY, IO3_4_KY2, IO3_5_KY, IO3_5_KY2, IO3_6_KY, IO3_6_KY2, IO3_7_KY, IO3_7_KY2, IO4_0_KY, IO4_0_KY2, IO4_1_KY, IO4_1_KY2, IO4_2_KY, IO4_2_KY2, IO4_3_KY, IO4_3_KY2, IO4_4_KY, IO4_4_KY2, IO4_5_KY, IO4_5_KY2, IO4_6_KY, IO4_6_KY2, IO4_7_KY, IO4_7_KY2, OE_KY, OE_KY2, RESET_KY, RESET_KY2, SCL_KY, SCL_KY2, SDA_KY, SDA_KY2, VDD_KY, VDD_KY2, VSS_KY, VSS_KY2

### Nets
GND: X3.4 X3.16 X3.27 X3.32 X3.44 X3.55 X3.57 X5.6 X5.11 X5.23 X5.34 X5.39 X5.51 ; port VSS_KY, port VSS_KY2  [also labelled VSS_PCA, VSS_PCA_2]
A0: X3.20 X5.27 ; port A0_KY, port A0_KY2  [also labelled A0_2]
A0_KY: D2.27 X4.27
A0_KY2: D3.20 X2.20
A1: X3.21 X5.28 ; port A1_KY, port A1_KY2  [also labelled A1_2]
A1_KY: D2.28 X4.28
A1_KY2: D3.21 X2.21
A2: X3.22 X5.29 ; port A2_KY, port A2_KY2  [also labelled A2_2]
A2_KY: D2.29 X4.29
A2_KY2: D3.22 X2.22
GND_KY2: D3.57 X2.57
INT_PCA: X3.48 X5.55 ; port INT_KY, port INT_KY2  [also labelled INT_PCA_2]
INT_PCA_KY: D2.55 X4.55
INT_PCA_KY2: D3.48 X2.48
IO0_0: X3.52 X5.3 ; port IO0_0_KY, port IO0_0_KY2  [also labelled IO0_0_2]
IO0_0_KY: D2.3 X4.3
IO0_0_KY2: D3.52 X2.52
IO0_1: X3.53 X5.4 ; port IO0_1_KY, port IO0_1_KY2  [also labelled IO0_1_2]
IO0_1_KY: D2.4 X4.4
IO0_1_KY2: D3.53 X2.53
IO0_2: X3.54 X5.5 ; port IO0_2_KY, port IO0_2_KY2  [also labelled IO0_2_2]
IO0_2_KY: D2.5 X4.5
IO0_2_KY2: D3.54 X2.54
IO0_3: X3.56 X5.7 ; port IO0_3_KY, port IO0_3_KY2  [also labelled IO0_3_2]
IO0_3_KY: D2.7 X4.7
IO0_3_KY2: D3.56 X2.56
IO0_4: X3.1 X5.8 ; port IO0_4_KY, port IO0_4_KY2  [also labelled IO0_4_2]
IO0_4_KY: D2.8 X4.8
IO0_4_KY2: D3.1 X2.1
IO0_5: X3.2 X5.9 ; port IO0_5_KY, port IO0_5_KY2  [also labelled IO0_5_2]
IO0_5_KY: D2.9 X4.9
IO0_5_KY2: D3.2 X2.2
IO0_6: X3.3 X5.10 ; port IO0_6_KY, port IO0_6_KY2  [also labelled IO0_6_2]
IO0_6_KY: D2.10 X4.10
IO0_6_KY2: D3.3 X2.3
IO0_7: X3.5 X5.12 ; port IO0_7_KY, port IO0_7_KY2  [also labelled IO0_7_2]
IO0_7_KY: D2.12 X4.12
IO0_7_KY2: D3.5 X2.5
IO1_0: X3.6 X5.13 ; port IO1_0_KY, port IO1_0_KY2  [also labelled IO1_0_2]
IO1_0_KY: D2.13 X4.13
IO1_0_KY2: D3.6 X2.6
IO1_1: X3.7 X5.14 ; port IO1_1_KY, port IO1_1_KY2  [also labelled IO1_1_2]
IO1_1_KY: D2.14 X4.14
IO1_1_KY2: D3.7 X2.7
IO1_2: X3.8 X5.15 ; port IO1_2_KY, port IO1_2_KY2  [also labelled IO1_2_2]
IO1_2_KY: D2.15 X4.15
IO1_2_KY2: D3.8 X2.8
IO1_3: X3.9 X5.16 ; port IO1_3_KY, port IO1_3_KY2  [also labelled IO1_3_2]
IO1_3_KY: D2.16 X4.16
IO1_3_KY2: D3.9 X2.9
IO1_4: X3.10 X5.17 ; port IO1_4_KY, port IO1_4_KY2  [also labelled IO1_4_2]
IO1_4_KY: D2.17 X4.17
IO1_4_KY2: D3.10 X2.10
IO1_5: X3.12 X5.19 ; port IO1_5_KY, port IO1_5_KY2  [also labelled IO1_5_2]
IO1_5_KY: D2.19 X4.19
IO1_5_KY2: D3.12 X2.12
IO1_6: X3.13 X5.20 ; port IO1_6_KY, port IO1_6_KY2  [also labelled IO1_6_2]
IO1_6_KY: D2.20 X4.20
IO1_6_KY2: D3.13 X2.13
IO1_7: X3.14 X5.21 ; port IO1_7_KY, port IO1_7_KY2  [also labelled IO1_7_2]
IO1_7_KY: D2.21 X4.21
IO1_7_KY2: D3.14 X2.14
IO2_0: X3.15 X5.22 ; port IO2_0_KY, port IO2_0_KY2  [also labelled IO2_0_2]
IO2_0_KY: D2.22 X4.22
IO2_0_KY2: D3.15 X2.15
IO2_1: X3.17 X5.24 ; port IO2_1_KY, port IO2_1_KY2  [also labelled IO2_1_2]
IO2_1_KY: D2.24 X4.24
IO2_1_KY2: D3.17 X2.17
IO2_2: X3.18 X5.25 ; port IO2_2_KY, port IO2_2_KY2  [also labelled IO2_2_2]
IO2_2_KY: D2.25 X4.25
IO2_2_KY2: D3.18 X2.18
IO2_3: X3.19 X5.26 ; port IO2_3_KY, port IO2_3_KY2  [also labelled IO2_3_2]
IO2_3_KY: D2.26 X4.26
IO2_3_KY2: D3.19 X2.19
IO2_4: X3.24 X5.31 ; port IO2_4_KY, port IO2_4_KY2  [also labelled IO2_4_2]
IO2_4_KY: D2.31 X4.31
IO2_4_KY2: D3.24 X2.24
IO2_5: X3.25 X5.32 ; port IO2_5_KY, port IO2_5_KY2  [also labelled IO2_5_2]
IO2_5_KY: D2.32 X4.32
IO2_5_KY2: D3.25 X2.25
IO2_6: X3.26 X5.33 ; port IO2_6_KY, port IO2_6_KY2  [also labelled IO2_6_2]
IO2_6_KY: D2.33 X4.33
IO2_6_KY2: D3.26 X2.26
IO2_7: X3.28 X5.35 ; port IO2_7_KY, port IO2_7_KY2  [also labelled IO2_7_2]
IO2_7_KY: D2.35 X4.35
IO2_7_KY2: D3.28 X2.28
IO3_0: X3.29 X5.36 ; port IO3_0_KY, port IO3_0_KY2  [also labelled IO3_0_2]
IO3_0_KY: D2.36 X4.36
IO3_0_KY2: D3.29 X2.29
IO3_1: X3.30 X5.37 ; port IO3_1_KY, port IO3_1_KY2  [also labelled IO3_1_2]
IO3_1_KY: D2.37 X4.37
IO3_1_KY2: D3.30 X2.30
IO3_2: X3.31 X5.38 ; port IO3_2_KY, port IO3_2_KY2  [also labelled IO3_2_2]
IO3_2_KY: D2.38 X4.38
IO3_2_KY2: D3.31 X2.31
IO3_3: X3.33 X5.40 ; port IO3_3_KY, port IO3_3_KY2  [also labelled IO3_3_2]
IO3_3_KY: D2.40 X4.40
IO3_3_KY2: D3.33 X2.33
IO3_4: X3.34 X5.41 ; port IO3_4_KY, port IO3_4_KY2  [also labelled IO3_4_2]
IO3_4_KY: D2.41 X4.41
IO3_4_KY2: D3.34 X2.34
IO3_5: X3.35 X5.42 ; port IO3_5_KY, port IO3_5_KY2  [also labelled IO3_5_2]
IO3_5_KY: D2.42 X4.42
IO3_5_KY2: D3.35 X2.35
IO3_6: X3.36 X5.43 ; port IO3_6_KY, port IO3_6_KY2  [also labelled IO3_6_2]
IO3_6_KY: D2.43 X4.43
IO3_6_KY2: D3.36 X2.36
IO3_7: X3.37 X5.44 ; port IO3_7_KY, port IO3_7_KY2  [also labelled IO3_7_2]
IO3_7_KY: D2.44 X4.44
IO3_7_KY2: D3.37 X2.37
IO4_0: X3.38 X5.45 ; port IO4_0_KY, port IO4_0_KY2  [also labelled IO4_0_2]
IO4_0_KY: D2.45 X4.45
IO4_0_KY2: D3.38 X2.38
IO4_1: X3.40 X5.47 ; port IO4_1_KY, port IO4_1_KY2  [also labelled IO4_1_2]
IO4_1_KY: D2.47 X4.47
IO4_1_KY2: D3.40 X2.40
IO4_2: X3.41 X5.48 ; port IO4_2_KY, port IO4_2_KY2  [also labelled IO4_2_2]
IO4_2_KY: D2.48 X4.48
IO4_2_KY2: D3.41 X2.41
IO4_3: X3.42 X5.49 ; port IO4_3_KY, port IO4_3_KY2  [also labelled IO4_3_2]
IO4_3_KY: D2.49 X4.49
IO4_3_KY2: D3.42 X2.42
IO4_4: X3.43 X5.50 ; port IO4_4_KY, port IO4_4_KY2  [also labelled IO4_4_2]
IO4_4_KY: D2.50 X4.50
IO4_4_KY2: D3.43 X2.43
IO4_5: X3.45 X5.52 ; port IO4_5_KY, port IO4_5_KY2  [also labelled IO4_5_2]
IO4_5_KY: D2.52 X4.52
IO4_5_KY2: D3.45 X2.45
IO4_6: X3.46 X5.53 ; port IO4_6_KY, port IO4_6_KY2  [also labelled IO4_6_2]
IO4_6_KY: D2.53 X4.53
IO4_6_KY2: D3.46 X2.46
IO4_7: X3.47 X5.54 ; port IO4_7_KY, port IO4_7_KY2  [also labelled IO4_7_2]
IO4_7_KY: D2.54 X4.54
IO4_7_KY2: D3.47 X2.47
OE: X3.23 X5.30 ; port OE_KY, port OE_KY2  [also labelled OE_2]
OE_KY: D2.30 X4.30
OE_KY2: D3.23 X2.23
RESET_PCA: X3.49 X5.56 ; port RESET_KY, port RESET_KY2  [also labelled RESET_PCA_2]  [project net RESET]
RESET_PCA_KY: D2.56 X4.56
RESET_PCA_KY2: D3.49 X2.49
SCL_PCA: X3.51 X5.2 ; port SCL_KY, port SCL_KY2  [also labelled SCL_PCA_2]
SCL_PCA_KY: D2.2 X4.2
SCL_PCA_KY2: D3.51 X2.51
SDA_PCA: X3.50 X5.1 ; port SDA_KY, port SDA_KY2  [also labelled SDA_PCA_2]
SDA_PCA_KY: D2.1 X4.1
SDA_PCA_KY2: D3.50 X2.50
VDD_PCA: X3.11 X3.39 X5.18 X5.46 ; port VDD_KY, port VDD_KY2  [also labelled VDD_PCA_2]
VDD_PCA_KY: D2.18 D2.46 X4.18 X4.46
VDD_PCA_KY2: D3.11 D3.39 X2.11 X2.39
VSS_PCA_KY: D2.6 D2.11 D2.23 D2.34 D2.39 D2.51 X4.6 X4.11 X4.23 X4.34 X4.39 X4.51
VSS_PCA_KY2: D3.4 D3.16 D3.27 D3.32 D3.44 D3.55 X2.4 X2.16 X2.27 X2.32 X2.44 X2.55

### Notes on the sheet
- ЧЕРТЕЖ КУВЗ
- (near X4) ПОСАДОЧНОЕ НА КУ
- (near X5) ПОСАДОЧНОЕ НА ТО
- Подп. и дата
- Инв. № дубл.
- Взам. инв. №
- Инв. № подл.
- Изм.
- Лист
- № докум.
- Подп.
- Дата
- Форма 2а ГОСТ 2.104-2006
- Копировал
- Формат А3
- (in symbol PCA9505DGG & PCA9506DGG) SDA; RESET; IO; SCL; INT; IO0_0; IO4_7; IO0_1; IO4_6; IO0_2; IO4_5; VSS; IO0_3; IO4_4; IO0_4; IO4_3; IO0_5; IO4_2; IO0_6; IO4_1; VDD; IO0_7; IO4_0; IO1_0; IO3_7; IO1_1; IO3_6; IO1_2; IO3_5; IO1_3; IO3_4; IO1_4; IO3_3; IO1_5; IO3_2; IO1_6; IO3_1; IO1_7; IO3_0; IO2_0; IO2_7; IO2_1; IO2_6; IO2_2; IO2_5; IO2_3; IO2_4; A0; OE; A1; A2
- (in symbol PCA9506BS) IO0_4; IO0_3; IO; IO0_5; VSS; IO0_6; IO0_2; IO0_1; IO0_7; IO0_0; IO1_0; SCL; IO1_1; SDA; IO1_2; RESET; IO1_3; INT; IO1_4; IO4_7; VDD; IO4_6; IO1_5; IO4_5; IO1_6; IO1_7; IO4_4; IO2_0; IO4_3; IO4_2; IO2_1; IO4_1; IO2_2; IO2_3; IO4_0; A0; IO3_7; A1; IO3_6; A2; IO3_5; OE; IO3_4; IO2_4; IO3_3; IO2_5; IO2_6; IO3_2; IO3_1; IO2_7; IO3_0; EP

### Library data of the parts
D2 = PCA9505DGG & PCA9506DGG
D3 = PCA9506BS

## Nets that join several sheets
GND: Main Scheme (14 pins), LEDS (6 pins), FK (X1.GND), RELE (8 pins), KY (13 pins)
+5V_CONST: FK (X1.+5V), RELE (8 pins)
+5V_VCC: Main Scheme (R53.1), FK (X1.+5V_VCCF X1.+5V_VCCS)
+5V_VDD: Main Scheme (R52.1), FK (X1.+5V_VDDF X1.+5V_VDDS)
A0: RELE (K3.4), KY (X3.20 X5.27)
A0_F: FK (X1.61), RELE (K3.5)
A0_MC: Main Scheme (D1.7X3), RELE (R54.2)
A1: RELE (K3.9), KY (X3.21 X5.28)
A1_F: FK (X1.62), RELE (K3.8)
A1_MC: Main Scheme (D1.9X3), RELE (R58.2)
A2: RELE (K4.4), KY (X3.22 X5.29)
A2_F: FK (X1.63), RELE (K4.5)
A2_MC: Main Scheme (D1.11X3), RELE (R55.2)
DI1_MC: Main Scheme (D1.21X3), FK (X1.IN-OUT1)
DO1_MC: Main Scheme (D1.25X3), FK (X1.OUT1)
DO2_MC: Main Scheme (D1.23X3), FK (X1.OUT2)
INT_PCA: Main Scheme (KP1.1 R50.2 R51.1), KY (X3.48 X5.55)
IO0_0: LEDS (VD43.2), FK (X1.9), KY (X3.52 X5.3)
IO0_1: LEDS (VD44.2), FK (X1.10), KY (X3.53 X5.4)
IO0_2: LEDS (VD45.2), FK (X1.11), KY (X3.54 X5.5)
IO0_3: LEDS (VD46.2), FK (X1.12), KY (X3.56 X5.7)
IO0_4: LEDS (VD47.2), FK (X1.13), KY (X3.1 X5.8)
IO0_5: LEDS (VD48.2), FK (X1.14), KY (X3.2 X5.9)
IO0_6: LEDS (VD49.2), FK (X1.15), KY (X3.3 X5.10)
IO0_7: LEDS (VD50.2), FK (X1.16), KY (X3.5 X5.12)
IO1_0: LEDS (VD3.2), FK (X1.33), KY (X3.6 X5.13)
IO1_1: LEDS (VD7.2), FK (X1.34), KY (X3.7 X5.14)
IO1_2: LEDS (VD11.2), FK (X1.35), KY (X3.8 X5.15)
IO1_3: LEDS (VD15.2), FK (X1.36), KY (X3.9 X5.16)
IO1_4: LEDS (VD19.2), FK (X1.37), KY (X3.10 X5.17)
IO1_5: LEDS (VD23.2), FK (X1.38), KY (X3.12 X5.19)
IO1_6: LEDS (VD27.2), FK (X1.39), KY (X3.13 X5.20)
IO1_7: LEDS (VD31.2), FK (X1.40), KY (X3.14 X5.21)
IO2_0: LEDS (VD4.2), FK (X1.49), KY (X3.15 X5.22)
IO2_1: LEDS (VD8.2), FK (X1.50), KY (X3.17 X5.24)
IO2_2: LEDS (VD12.2), FK (X1.51), KY (X3.18 X5.25)
IO2_3: LEDS (VD16.2), FK (X1.52), KY (X3.19 X5.26)
IO2_4: LEDS (VD20.2), FK (X1.53), KY (X3.24 X5.31)
IO2_5: LEDS (VD24.2), FK (X1.54), KY (X3.25 X5.32)
IO2_6: LEDS (VD28.2), FK (X1.55), KY (X3.26 X5.33)
IO2_7: LEDS (VD32.2), FK (X1.56), KY (X3.28 X5.35)
IO3_0: LEDS (VD5.2), FK (X1.41), KY (X3.29 X5.36)
IO3_1: LEDS (VD9.2), FK (X1.42), KY (X3.30 X5.37)
IO3_2: LEDS (VD13.2), FK (X1.43), KY (X3.31 X5.38)
IO3_3: LEDS (VD17.2), FK (X1.44), KY (X3.33 X5.40)
IO3_4: LEDS (VD21.2), FK (X1.45), KY (X3.34 X5.41)
IO3_5: LEDS (VD25.2), FK (X1.46), KY (X3.35 X5.42)
IO3_6: LEDS (VD29.2), FK (X1.47), KY (X3.36 X5.43)
IO3_7: LEDS (VD33.2), FK (X1.48), KY (X3.37 X5.44)
IO4_0: LEDS (VD6.2), FK (X1.17), KY (X3.38 X5.45)
IO4_1: LEDS (VD10.2), FK (X1.18), KY (X3.40 X5.47)
IO4_2: LEDS (VD14.2), FK (X1.19), KY (X3.41 X5.48)
IO4_3: LEDS (VD18.2), FK (X1.20), KY (X3.42 X5.49)
IO4_4: LEDS (VD22.2), FK (X1.21), KY (X3.43 X5.50)
IO4_5: LEDS (VD26.2), FK (X1.22), KY (X3.45 X5.52)
IO4_6: LEDS (VD30.2), FK (X1.23), KY (X3.46 X5.53)
IO4_7: LEDS (VD34.2), FK (X1.24), KY (X3.47 X5.54)
LED_READ: Main Scheme (D1.17X3), LEDS (R41.1)
LED_WRITE: Main Scheme (D1.19X3), LEDS (R42.1)
OE: Main Scheme (KP6.1), RELE (K4.9), KY (X3.23 X5.30)
OE_F: FK (X1.64), RELE (K4.8)
OE_MC: Main Scheme (D1.13X3), RELE (R59.2 R64.1)
RELE1: Main Scheme (D1.8X3), LEDS (R43.1), RELE (R5.1)
RELE2: Main Scheme (D1.10X3), LEDS (R44.1), RELE (R6.1)
RELE3: Main Scheme (D1.12X3), LEDS (R65.1), RELE (R60.1)
RELE4: Main Scheme (D1.14X3), LEDS (R66.1), RELE (R61.1)
RESET: Main Scheme (KP5.1), RELE (K2.9), KY (X3.49 X5.56)
RESET_F: FK (X1.60), RELE (K2.8)
RESET_MC: Main Scheme (D1.5X3 R49.1), RELE (R56.2 R57.1)
RST_IN: Main Scheme (R49.2), FK (X1.OUT3)
SCL_F: FK (X1.58), RELE (K1.5)
SCL_MC: Main Scheme (D1.15X2), RELE (R1.2 R2.1)
SCL_PCA: Main Scheme (KP2.1), RELE (K1.4), KY (X3.51 X5.2)
SDA_F: FK (X1.59), RELE (K1.8)
SDA_MC: Main Scheme (D1.16X2), RELE (R3.2 R4.1)
SDA_PCA: Main Scheme (KP3.1), RELE (K1.9), KY (X3.50 X5.1)
VCC_MC: Main Scheme (7 pins), RELE (R2.2 R4.2 R57.2 R64.2)
VDD: LEDS (40 pins), RELE (K2.3)
VDD_PCA: Main Scheme (7 pins), RELE (K2.4), KY (X3.11 X3.39 X5.18 X5.46)